# Altium project Debugging Board V1.PrjPcb
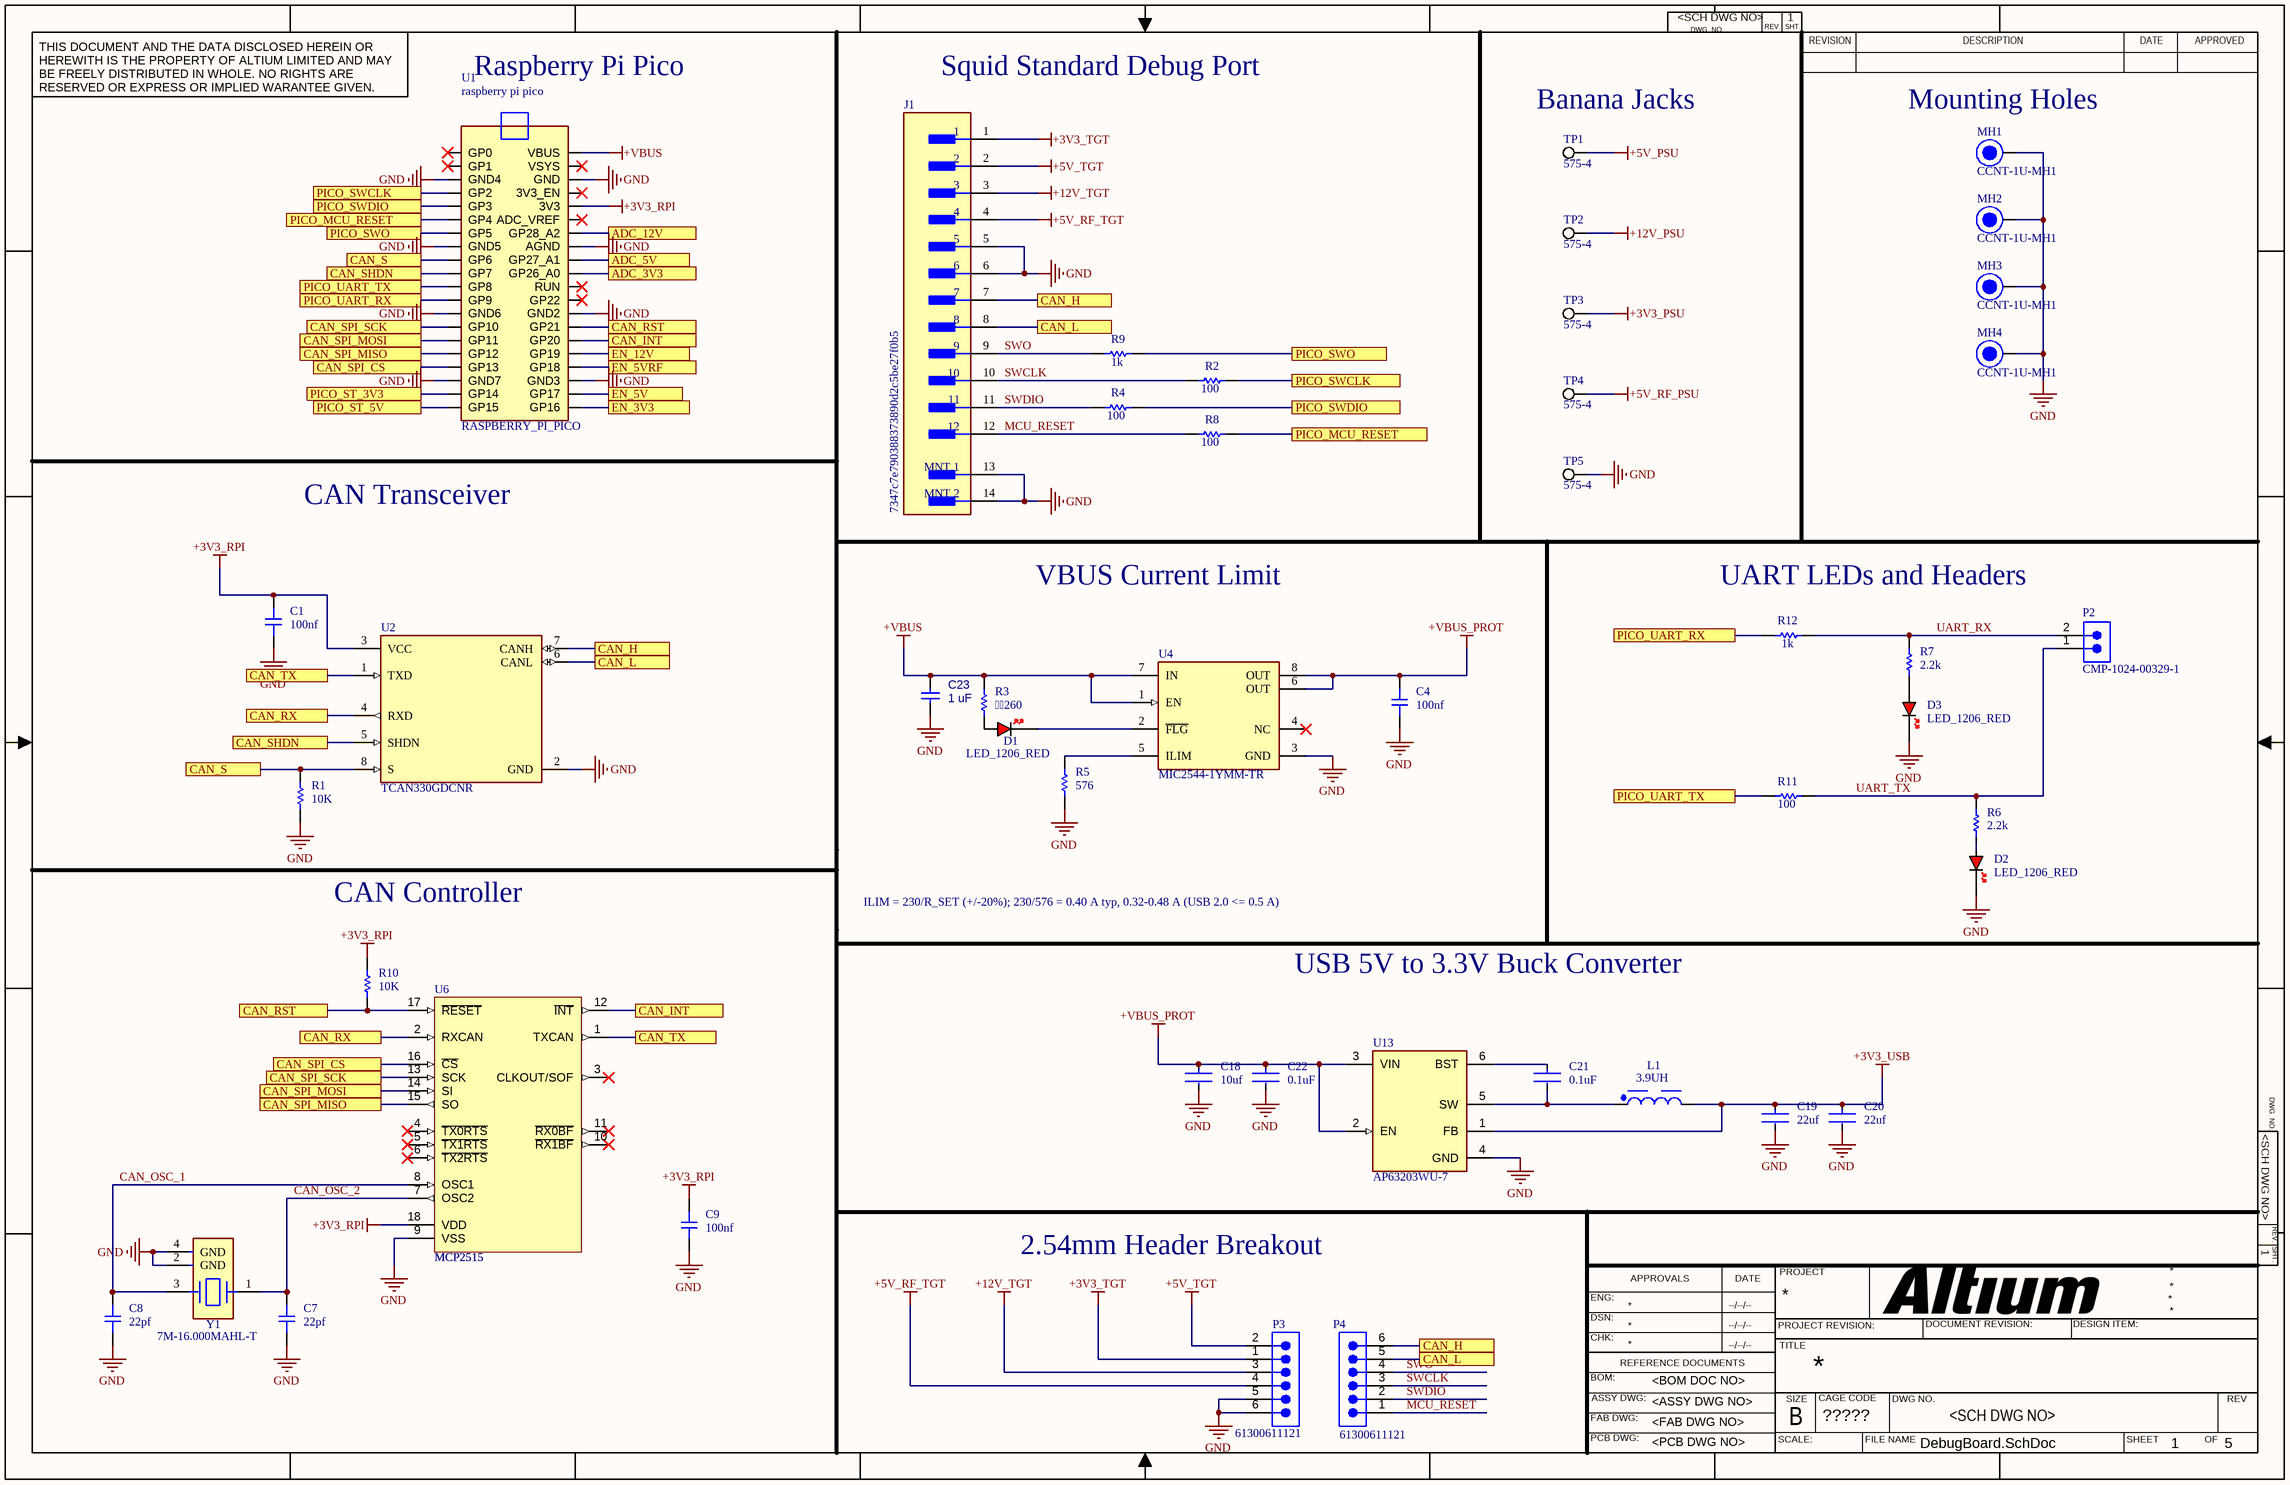
[diagram p0: DebugBoard.SchDoc]
CAGE_CODE: ?????; CONTRACT_NUMBER: <CONTRACT NO>; DOC_NO_ASSY_DWG: <ASSY DWG NO>; DOC_NO_BOM: <BOM DOC NO>; DOC_NO_FAB_DWG: <FAB DWG NO>; DOC_NO_SCH_DWG: <SCH DWG NO>; PCB_2_DEC_TOL: +/-.01; PCB_3_DEC_TOL: +/-.010; PCB_ANG_TOL: +/-1/2; PCB_ASSEMBLY_NO: <PCB ASSY NO>; PCB_CHECKER: - -----; PCB_CHECKER_APP_DATE: --/--/----; PCB_DESIGNER: - -----; PCB_DESIGNER_APP_DATE: --/--/----; PCB_DWG_NO: <PCB DWG NO>; PCB_ENGINEER: - -----; PCB_ENGINEER_APP_DATE: --/--/----; PCB_PART_NUMBER: <PCB PN>; PCB_REV: A; SCH_REV: A
6 sheets, 161 parts. Net scope: global (net labels, ports and power ports of the same name join across sheets).
Board file: DebugBoard.PcbDoc
Sheets:
  DebugBoard.SchDoc
  DebugBoardMuxes.SchDoc
  DebugBoardPowerControl.SchDoc
  DebugBoard3V3Mux.SchDoc
  DebugBoard5VMux.SchDoc
  DebugBoardLimiters.SchDoc

## Sheet DebugBoard.SchDoc
size 431 x 279 mm; SheetNumber: 1; SheetTotal: 5; ENG_APP_DATE: --/--/--; DSN_APP_DATE: --/--/--; CHK_APP_DATE: --/--/--

### Parts
C1  100nf  [CAP_0805]
C4  100nf  [CAP_0805]
C7  22pf  [CAP_0805]
C8  22pf  [CAP_0805]
C9  100nf  [CAP_0805]
C18  10uf  [FP-CGA5L-0_3-0_1-IPC_A]
C19  22uf  [FP-GCM31C-0_2-e0_3_0_8-IPC_A]
C20  22uf  [FP-GCM31C-0_2-e0_3_0_8-IPC_A]
C21  0.1uF  [FP-C0805C-DN-MFG]
C22  0.1uF  [FP-C0805C-DN-MFG]
C23  1 uF  [CAPC2013X145X50ML20T25]
D1  LED_1206_RED  [LED_1206_RED]
D2  LED_1206_RED  [LED_1206_RED]
D3  LED_1206_RED  [LED_1206_RED]
J1  7347c7e790388373890d2c5be27f0b5  [FP-BM12B-GHS-TBT_LF_SN-MFG]
L1  3.9UH  [WE-PD2SR_7850]
MH1  CCNT-1U-MH1  [CCNT-1U-MH1-Footprint-1]
MH2  CCNT-1U-MH1  [CCNT-1U-MH1-Footprint-1]
MH3  CCNT-1U-MH1  [CCNT-1U-MH1-Footprint-1]
MH4  CCNT-1U-MH1  [CCNT-1U-MH1-Footprint-1]
P2  CMP-1024-00329-1  [SMTC-TSW-102-26-XX-S]
P3  61300611121  [61300611121]
P4  61300611121  [61300611121]
R1  10K  [RES_0805]
R2  100  [RES_0805]
R3  260  [RES_0805]
R4  100  [RES_0805]
R5  576  [RES_0805]
R6  2.2k  [RES_0805]
R7  2.2k  [RES_0805]
R8  100  [RES_0805]
R9  1k  [RES_0805]
R10  10K  [RES_0805]
R11  100  [RES_0805]
R12  1k  [RES_0805]
TP1  575-4  [KSTN-575-4]
TP2  575-4  [KSTN-575-4]
TP3  575-4  [KSTN-575-4]
TP4  575-4  [KSTN-575-4]
TP5  575-4  [KSTN-575-4]
U1  RASPBERRY_PI_PICO  [RASPBERRY_PI_PICO]
U2  TCAN330GDCNR  [FP-DCN0008A-MFG]
U4  MIC2544-1YMM-TR  [FP-MSOP-8LD-PL-1-MFG]
U6  MCP2515  [SOIC-SO18_M]
U13  AP63203WU-7  [FP-TSOT26-MFG]
Y1  7M-16.000MAHL-T  [FP-7M-MFG]

### Ports
ADC_3V3, ADC_5V, ADC_12V, CAN_H, CAN_INT, CAN_L, CAN_RST, CAN_RX, CAN_S, CAN_SHDN, CAN_SPI_CS, CAN_SPI_MISO, CAN_SPI_MOSI, CAN_SPI_SCK, CAN_TX, EN_3V3, EN_5V, EN_5VRF, EN_12V, PICO_MCU_RESET, PICO_ST_3V3, PICO_ST_5V, PICO_SWCLK, PICO_SWDIO, PICO_SWO, PICO_UART_RX, PICO_UART_TX

### Nets
+3V3_PSU: TP3.1
+3V3_RPI: C1.2 C9.2 R10.2 U1.3V3 U2.3(VCC) U6.18(VDD)
+3V3_TGT: J1.1 P3.1
+3V3_USB: C19.1 C20.1 L1.2 U13.1(FB)
+5V_PSU: TP1.1
+5V_RF_PSU: TP4.1
+5V_RF_TGT: J1.4 P3.4
+5V_TGT: J1.2 P3.2
+12V_PSU: TP2.1
+12V_TGT: J1.3 P3.3
+VBUS: C23.1 R3.2 U1.VBUS U4.1(EN) U4.7(IN)
+VBUS_PROT: C4.2 C18.1 C22.1 U4.6(OUT) U4.8(OUT) U13.2(EN) U13.3(VIN)
GND: C1.1 C4.1 C7.1 C8.1 C9.1 C18.2 C19.2 C20.2 C22.2 C23.2 D2.K D3.K J1.5 J1.6 J1.13(MNT_1) J1.14(MNT_2) MH1.MH1 MH2.MH1 MH3.MH1 MH4.MH1 P3.5 P3.6 R1.1 R5.2 TP5.1 U1.AGND U1.GND U1.GND2 U1.GND3 U1.GND4 U1.GND5 U1.GND6 U1.GND7 U2.2(GND) U4.3(GND) U6.9(VSS) U13.4(GND) Y1.2(GND) Y1.4(GND)
ADC_3V3: U1.GP26_A0 ; port ADC_3V3
ADC_5V: U1.GP27_A1 ; port ADC_5V
ADC_12V: U1.GP28_A2 ; port ADC_12V
CAN_H: J1.7 P4.6 U2.7(CANH) ; port CAN_H
CAN_INT: U1.GP20 U6.12(~{INT}) ; port CAN_INT
CAN_L: J1.8 P4.5 U2.6(CANL) ; port CAN_L
CAN_OSC_1: C8.2 U6.8(OSC1) Y1.3
CAN_OSC_2: C7.2 U6.7(OSC2) Y1.1
CAN_RST: R10.1 U1.GP21 U6.17(~{RESET}) ; port CAN_RST
CAN_RX: U2.4(RXD) U6.2(RXCAN) ; port CAN_RX
CAN_S: R1.2 U1.GP6 U2.8(S) ; port CAN_S
CAN_SHDN: U1.GP7 U2.5(SHDN) ; port CAN_SHDN
CAN_SPI_CS: U1.GP13 U6.16(~{CS}) ; port CAN_SPI_CS
CAN_SPI_MISO: U1.GP12 U6.15(SO) ; port CAN_SPI_MISO
CAN_SPI_MOSI: U1.GP11 U6.14(SI) ; port CAN_SPI_MOSI
CAN_SPI_SCK: U1.GP10 U6.13(SCK) ; port CAN_SPI_SCK
CAN_TX: U2.1(TXD) U6.1(TXCAN) ; port CAN_TX
EN_3V3: U1.GP16 ; port EN_3V3
EN_5V: U1.GP17 ; port EN_5V
EN_5VRF: U1.GP18 ; port EN_5VRF
EN_12V: U1.GP19 ; port EN_12V
MCU_RESET: J1.12 P4.1 R8.2
PICO_MCU_RESET: R8.1 U1.GP4 ; port PICO_MCU_RESET
PICO_ST_3V3: U1.GP14 ; port PICO_ST_3V3
PICO_ST_5V: U1.GP15 ; port PICO_ST_5V
PICO_SWCLK: R2.1 U1.GP2 ; port PICO_SWCLK
PICO_SWDIO: R4.1 U1.GP3 ; port PICO_SWDIO
PICO_SWO: R9.1 U1.GP5 ; port PICO_SWO
PICO_UART_RX: R12.1 U1.GP9 ; port PICO_UART_RX
PICO_UART_TX: R11.1 U1.GP8 ; port PICO_UART_TX
SWCLK: J1.10 P4.3 R2.2
SWDIO: J1.11 P4.2 R4.2
SWO: J1.9 P4.4 R9.2
UART_RX: P2.2 R7.2 R12.2
UART_TX: P2.1 R6.2 R11.2
NetC21_1: C21.1 U13.6(BST)
NetC21_2: C21.2 L1.1 U13.5(SW)
NetD1_A: D1.A R3.1
NetD1_K: D1.K U4.2(~{FLG})
NetD2_A: D2.A R6.1
NetD3_A: D3.A R7.1
NetR5_1: R5.1 U4.5(ILIM)

Not connected (* = marked no-connect by the designer): U1 3V3_EN* ADC_VREF* GP0* GP1* GP22* RUN* VSYS*; U4 4(NC)*; U6 3(CLKOUT/SOF)* 4(~{TX0RTS})* 5(~{TX1RTS})* 6(~{TX2RTS})* 10(~{RX1BF})* 11(~{RX0BF})*

### Notes on the sheet
- Raspberry Pi Pico
- Squid Standard Debug Port
- (near TP1) Banana Jacks
- (near MH1) Mounting Holes
- CAN Transceiver
- VBUS Current Limit
- UART LEDs and Headers
- CAN Controller
- ILIM = 230/R_SET (+/-20%); 230/576 = 0.40 A typ, 0.32-0.48 A (USB 2.0 <= 0.5 A)
- USB 5V to 3.3V Buck Converter
- 2.54mm Header Breakout
- DWG. NO.
- REV.
- SHT.
- THIS DOCUMENT AND THE DATA DISCLOSED HEREIN OR HEREWITH IS THE PROPERTY OF ALTIUM LIMITED AND MAY BE FREELY DISTRIBUTED IN WHOLE. NO RIGHTS ARE RESERVED OR EXPRESS OR IMPLIED WARANTEE GIVEN.
- REVISION
- DESCRIPTION
- DATE
- APPROVED
- ENG:
- APPROVALS
- PROJECT
- DSN:
- CHK:
- REFERENCE DOCUMENTS
- PROJECT REVISION:
- TITLE
- DOCUMENT REVISION:
- DESIGN ITEM:
- BOM:
- FAB DWG:
- PCB DWG:
- ASSY DWG:
- SCALE:
- SIZE
- B
- CAGE CODE
- FILE NAME
- DWG NO.
- SHEET
- OF
- REV
- (in symbol CMP-204-000001-1) raspberry pi pico

### Library data of the parts
C1 C4 C7-C9 = CMP-001-00121-1: Capacitor SMD 0805 - Generic; Source: Generic_Schematic_Library.SchLib; Design Item ID: CAP_0805
C18 = CMP-08246-002111-1: Cap Ceramic 10uF 35V X7R 10% Pad SMD 1206 +125°C Automotive T/R; Height: 1.6mm; Thickness: 0.075inch; Tolerance: 10%; Voltage Rating (DC): 35V; Min Operating Temperature: -55°C; Width: 0.063inch; Ratings: AEC-Q200; Dielectric: X7R; Voltage Rating: 35V; REACH SVHC: No SVHC; Case Code (Imperial): 1206; Features: Soft Termination; Mount: Surface Mount; Case Code (Metric): 3216; Lead Free: Lead Free; Length: 0.126inch; Package Quantity: 2000; Packaging: Tape and Reel; Case/Package: 1206; Capacitance: 10uF; Max Operating Temperature: 125°C; Weight: 0.000571oz; Termination: SMD/SMT
C19 C20 = CMP-06035-059468-1: Ceramic Capacitor for Automotive 22uF ±10% 10VDC X7R 1206 Embossed T/R
C21 C22 = CMP-03020-000950-1: CAP CER 0.1UF 50V X7R 0805; Manufacturer: KEMET; Manufacturer Part Number: C0805C104J5RACTU; Temperature Coefficient: 30ppm/°C; Value: 0.10 μF; Material: Ceramic; Tolerance: 0.05; Voltage Rating: 50 V; Digikey Description: CAP CER 0.1UF 50V X7R 0805; Octopart: https://octopart.com/c0805c104j5ractu-kemet-104634; RoHS: TRUE; Device Class L1: Passive Components; Temperature Characteristic: X7R; Device Class L3: Ceramic Capacitors; Lead Free: Yes; Automotive: No; Category: Cap; Temperature: -55°C to +125°C; Package: C0805C-DN; Temperature Range High: +125°C; Height: 0.88mm; Capacitance: 0.10 μF; Temperature Range Low: -55°C; ComponentLink2Description: Datasheet; ComponentLink2URL: https://content.kemet.com/datasheets/KEM_C1003_C0G_SMD.pdf; Ipc Land Pattern Name: CAPC200125X78; Device Class L2: Capacitors; Mouser Description: Multilayer Ceramic Capacitors MLCC - SMD/SMT 50volts 0.1uF X7R 5%
C23 = CMP-001-00010-9: Chip Capacitor, 1 uF, +/-10%, 25 V, 0805 (2012 Metric); Voltage Rating: 25V; Value: 1µF; Tolerance: 10%; Capacitor Type: Ceramic; Min Operating Temperature: -55°C; Max Operating Temperature: 125°C; Pins: 2; Mounting Technology: SM; RoHS Compliant: True; Case/Package: 0805
D1-D3 = CMP-004-00077-1: LED 1206 RED SMD; Source: Generic_Schematic_Library.SchLib; Design Item ID: LED_1206_RED
J1 = CMP-002-00170-1: CONN HEADER SMD 12POS 1.25MM; Current Rating: 1A; Number Of Contacts: 12; Voltage Rating (AC): 50V; Wire/Cable Gauge: 26AWG; Orientation: Straight; Reach SVHC Compliant: Yes; Contact Material: Bronze; Source: SquidSat Deployable Antenna REV1_1.SCHLIB; Packaging: Cut Tape; Termination: SMD/SMT; Number of Rows: 1; Min Operating Temperature: -25°C; Mount: Surface Mount; Pitch: 1.25mm; Housing Material: Nylon; Number of Positions: 12; Voltage Rating: 50V; Housing Color: Natural; Max Operating Temperature: 85°C; Lead Free: Lead Free; Contact Plating: Tin; Series: GH; Design Item ID: 7347c7e790388373890d2c5be27f0b5
L1 = CMP-1397-00011-3: Fixed Ind 3.9UH 3.8A 20 Mohm SMD; Core Material: Composite, Ferrite; Inductance: 3.9µH; Series Resistance: 16.7mΩ; Tolerance: 30%; Test Frequency: 100kHz; Shielding: Shielded; Self Resonant Frequency: 45MHz; Saturation Current: 4A; Number of Pins: 2; Max Operating Temperature: 125°C; Mount: Surface Mount; Length: 7.8mm; DC Resistance (DCR): 16.7mΩ; Case/Package: SMD/SMT; Min Operating Temperature: -40°C; Width: 7mm; REACH SVHC: Unknown; RMS Current (Irms): 3.8A; Max DC Current: 3.8A; Composition: Wirewound; Termination: SMD/SMT; Inductance Tolerance: 30%; Ambient Temperature Range High: 85°C; Ambient Temperature Range Low: -40°C; Depth: 7mm; Height - Seated (Max): 4.4958mm; RoHS: Compliant; Height: 4.8mm; Current Rating: 3.8A
MH1-MH4 = CMP-002-00076-1: BOTTOM LEFT Mounting Hole for blank 1U CubeSat template used on CCNT
P2 = CMP-002-00166-1: 0.025" SQ Post Header, Through-hole, Vertical, -55 to 125 degC, 2.54 mm Pitch, 2-Pin, Male, RoHS; Manufacturer: Samtec; PartNumber: TSW-102-26-F-S; Available Preview Images: 2D; Pitch: 2.54 mm; ComponentLink1URL: http://www.samtec.com; Design Item ID: CMP-1024-00329-1; DatasheetVersion: F-214; Orientation: Vertical; Mounting Technology: Through-hole; ComponentLink2URL: http://www.samtec.com/documents/webfiles/pdf/TSW_TH.PDF; ComponentLink3URL: http://www.samtec.com/documents/webfiles/cpdf/TSW-XXX-XX-XXX-X-XX-XXX-MKT.pdf; ComponentLink2Description: Datasheet; Source: SquidSat Deployable Antenna REV1_1.SCHLIB; ComponentLink3Description: Package Specification; RoHS: True; Temperature Range: -55 to 125 degC; PackageVersion: DM, 8/1988; PackageReference: TSW-102-26-XX-S; PackageDescription: .025[0.64] SQ. Post Terminal Strip Assembly; ComponentLink1Description: Manufacturer URL
P3 P4 = CMP-1502-01070-4: THT Vertical Pin Header WR-PHD, Pitch 2.54 mm, Single Row, 6 pins; Pitch: 2.54mm; Operating Supply Voltage: 250V; Connector Type: Male Pin; Gender: Male; Number of Positions: 6; Contact Resistance: 20mΩ; Current Rating: 3A; Termination: Through Hole; Color: Black; Number of Pins: 6; Lead Pitch: 2.54mm; Height: 8.89mm; RoHS: Compliant; Lead Free: Lead Free; Contact Mating Length: 5.9944mm; Contact Plating: Gold; Contact Gender: Male; Packaging: Bulk; Orientation: Vertical; Mount: Through Hole; Voltage Rating: 250V; Number of Rows: 1; Max Operating Temperature: 105°C; Min Operating Temperature: -40°C; Housing Material: PBT; Contact Material: Gold; Number of Contacts: 6
R1-R12 = CMP-009-00183-1: Resistor SMD 0805 - Generic; Source: Generic_Schematic_Library.SchLib; Design Item ID: RES_0805
TP1-TP5 = CMP-2000-05649-1: Banana Jack, Non-Insulated, 1-Pin THD, RoHS, Bulk; Manufacturer: Keystone-Electronics; Package Version: Rev. B, 11/1994; Plug/Mating Plug Diameter: StandardBanana; Gender: Female; Package Reference: 575-4; Operating Temperature: -; Contact Material: Brass; Packaging: Bulk; Series: -; Category: Connectors,Interconnects; Color: -; Type: BananaJack; Contact Finish: Nickel; Features: -; Family: BananaandTipConnectors-Jacks,Plugs; Body Material: -; Manufacturer URL: http://www.keyelco.com/; Termination: Solder; Insulation: Non-Insulated; Datasheet Version: Rev. B, 11/1994; Mounting Technology: ThroughHole; Package URL: http://www.keyelco.com/product-pdf.cfm?p=2379; Mounting Type: ThroughHole; Package Description: 1-Pin Through Hole Device, Dia 7.92 mm; Datasheet URL: http://www.keyelco.com/product-pdf.cfm?p=2379; Wire Gauge: -
U1 = CMP-204-000001-1: Raspberry Pi Board, Arm Cortex-M0+; Core Architecture:Arm; Core Sub-Architecture:Cortex-M0+; Kit Contents:Raspberry Pi Pico Board; No. Of Bits:32Bit; Silicon Core Number:Rp2040; Silicon Manufacturer:Raspberry Pi; Component Type: Standard; Pin Count: 40; Design Item ID: RASPBERRY_PI_PICO; Value: RASPBERRY_PI_PICO; Source: RASPBERRY_PI_PICO.SchLib; MP: RASPBERRY PI PICO; Package: None; MF: Raspberry Pi; SnapEDA_Link: https://www.snapeda.com/parts/RASPBERRY%20PI%20PICO/Raspberry+Pi/view-part/?ref=snap; Check_prices: https://www.snapeda.com/parts/RASPBERRY%20PI%20PICO/Raspberry+Pi/view-part/?ref=eda
U2 = CMP-031-00060-1: IC TRANSCEIVER 1/1 SOT23-8; Data Rate: 1Mbps; Lead Free: Lead Free; Pin Count: 8; Mount: Surface Mount; Min Operating Temperature: -40°C; Packaging: Tape and Reel; Case/Package: SOT-23-8; Source: Squid FCR V0.SCHLIB; Component Type: Standard; Max Operating Temperature: 125°C; Design Item ID: CMP-04872-000178-1; RoHS Compliant: Yes
U4 = CMP-00008-1: IC SW CURR LIMIT HI SIDE 8-MSOP / USB Power Switch Single 5.5V 0.1A to 1.5A 8-Pin MSOP T/R; Manufacturer Lifecycle Status: REL; Fault Protection: Over Temperature; Output Configuration: High Side; Number of Outputs: 1; On-State Resistance: 120mΩ; Turn-Off Delay Time: 22µs; Value: 120mΩ; Nominal Supply Current: 5µA; Min Supply Voltage: 2.7V; Turn-On Delay Time: 2ms; RoHS: Compliant; Min Operating Temperature: -40°C; Current Rating: 1.5A; Max Operating Temperature: 125°C; Lifecycle Status: Production; Lead Free: Lead Free; Radiation Hardening: No; Max Supply Voltage: 5.5V; Schedule B: 8542390000, 8542390000; Case/Package: MSOP; Max Output current: 1.5A; Projected EOL Date: 2034-06-14; Ambient Temperature Range High: 85°C; Pins: 8; Country of Origin: Thailand; HS Code: 8542.39.0090; Number of Channels: 1; Mounting Technology: Surface Mount; Nominal Supply Voltage: 5.5V; Country of Fabrication: United States of America; Height: 1.1mm; Output Current: 1.5A; Export Control Classification Number (ECCN) Code: EAR99; Part Series: -; Country of Assembly: Thailand; Harmonized Tariff Schedule (HTS) Code: 8542.39.0060
U6 = CMP-330-000002-1: Stand-Alone CAN Controller With SPI Interface, 18-Pin SOIC, Extended Temperature; Design Item ID: CMP-0186-00035-2; ComponentLink1Description: Manufacturer URL; PackageDescription: 18-Lead Plastic Small Outline (SO) - Wide 7.50mm Body [SOIC]; Code_JEDEC: MS-013; PackageVersion: revBB, Aug-2009; Source: Squid FCR V0.SCHLIB; ComponentLink3URL: http://www.microchip.com/stellent/groups/techpub_sg/documents/packagingspec/en012702.pdf; DatasheetVersion: revF, Oct-2010; RevisionNote: URLs added. DatasheetVersion updated.; Component Type: Standard; Pin Count: 18; Value: MCP2515; ComponentLink2URL: http://ww1.microchip.com/downloads/en/DeviceDoc/21801f.pdf; ComponentLink3Description: Package Specification; ComponentLink1URL: http://www.microchip.com/; PackageReference: SOIC-SO18; ComponentLink2Description: Datasheet
U13 = CMP-12757-000006-1: IC REG BUCK 3.3V 2A TSOT26; Manufacturer: Diodes Inc.; Output Type: Fixed; Min Supply Voltage: 3.8V; Number Of Outputs: 1; Max Junction Temp: +160°C; Nominal Supply Current: 22uA; Standoff Height: 0.01mm; Switching Frequency: 1.1MHz; Max Supply Voltage: 32V; ComponentLink2Description: Datasheet; Device Class L1: Integrated Circuits (ICs); Temperature: to +160°C; Device Class L3: Voltage Regulators - Switching; RoHS: TRUE; Octopart: https://octopart.com/ap63203wu-7-diodes+inc.-98099550; Output Voltage: 3.3V; Lead Free: Yes; ComponentLink2URL: https://www.diodes.com/assets/Datasheets/AP63200-AP63201-AP63203-AP63205.pdf; Digikey Description: IC REG BUCK 3.3V 2A TSOT26; Footprint Url: https://www.diodes.com/assets/Package-Files/TSOT26.pdf; Ambient Temperature Range High: +85°C; Height: 1mm; Automotive: No; Temperature Range High: +160°C; Switching Topology: Buck; Output Current: 2A; Package: TSOT26; Category: IC; Mouser Description: AP63203 Series 3.3 V 2 A SMT Fixed Low IQ Synchronous Buck - TSOT-26; Device Class L2: Power Management ICs; Ambient Temperature Range Low: -40°C; Manufacturer Part Number: AP63203WU-7
Y1 = CMP-003-00073-1: Crystal 16MHz, 30ppm, 22pF, 60O; ESR (Equivalent Series Resistance): 80; Pins: 4; Component Type: Standard; Min Operating Temperature: -40°C; Frequency: 16MHz; Frequency Stability: 30ppm; Max Operating Temperature: 85°C; Frequency Tolerance: 30ppm; Load Capacitance: 22pF; Design Item ID: CMP-18717-000072-1; Source: Squid FCR V0.SCHLIB

## Sheet DebugBoardMuxes.SchDoc
size 420 x 297 mm; SheetNumber: 2; SheetTotal: 2
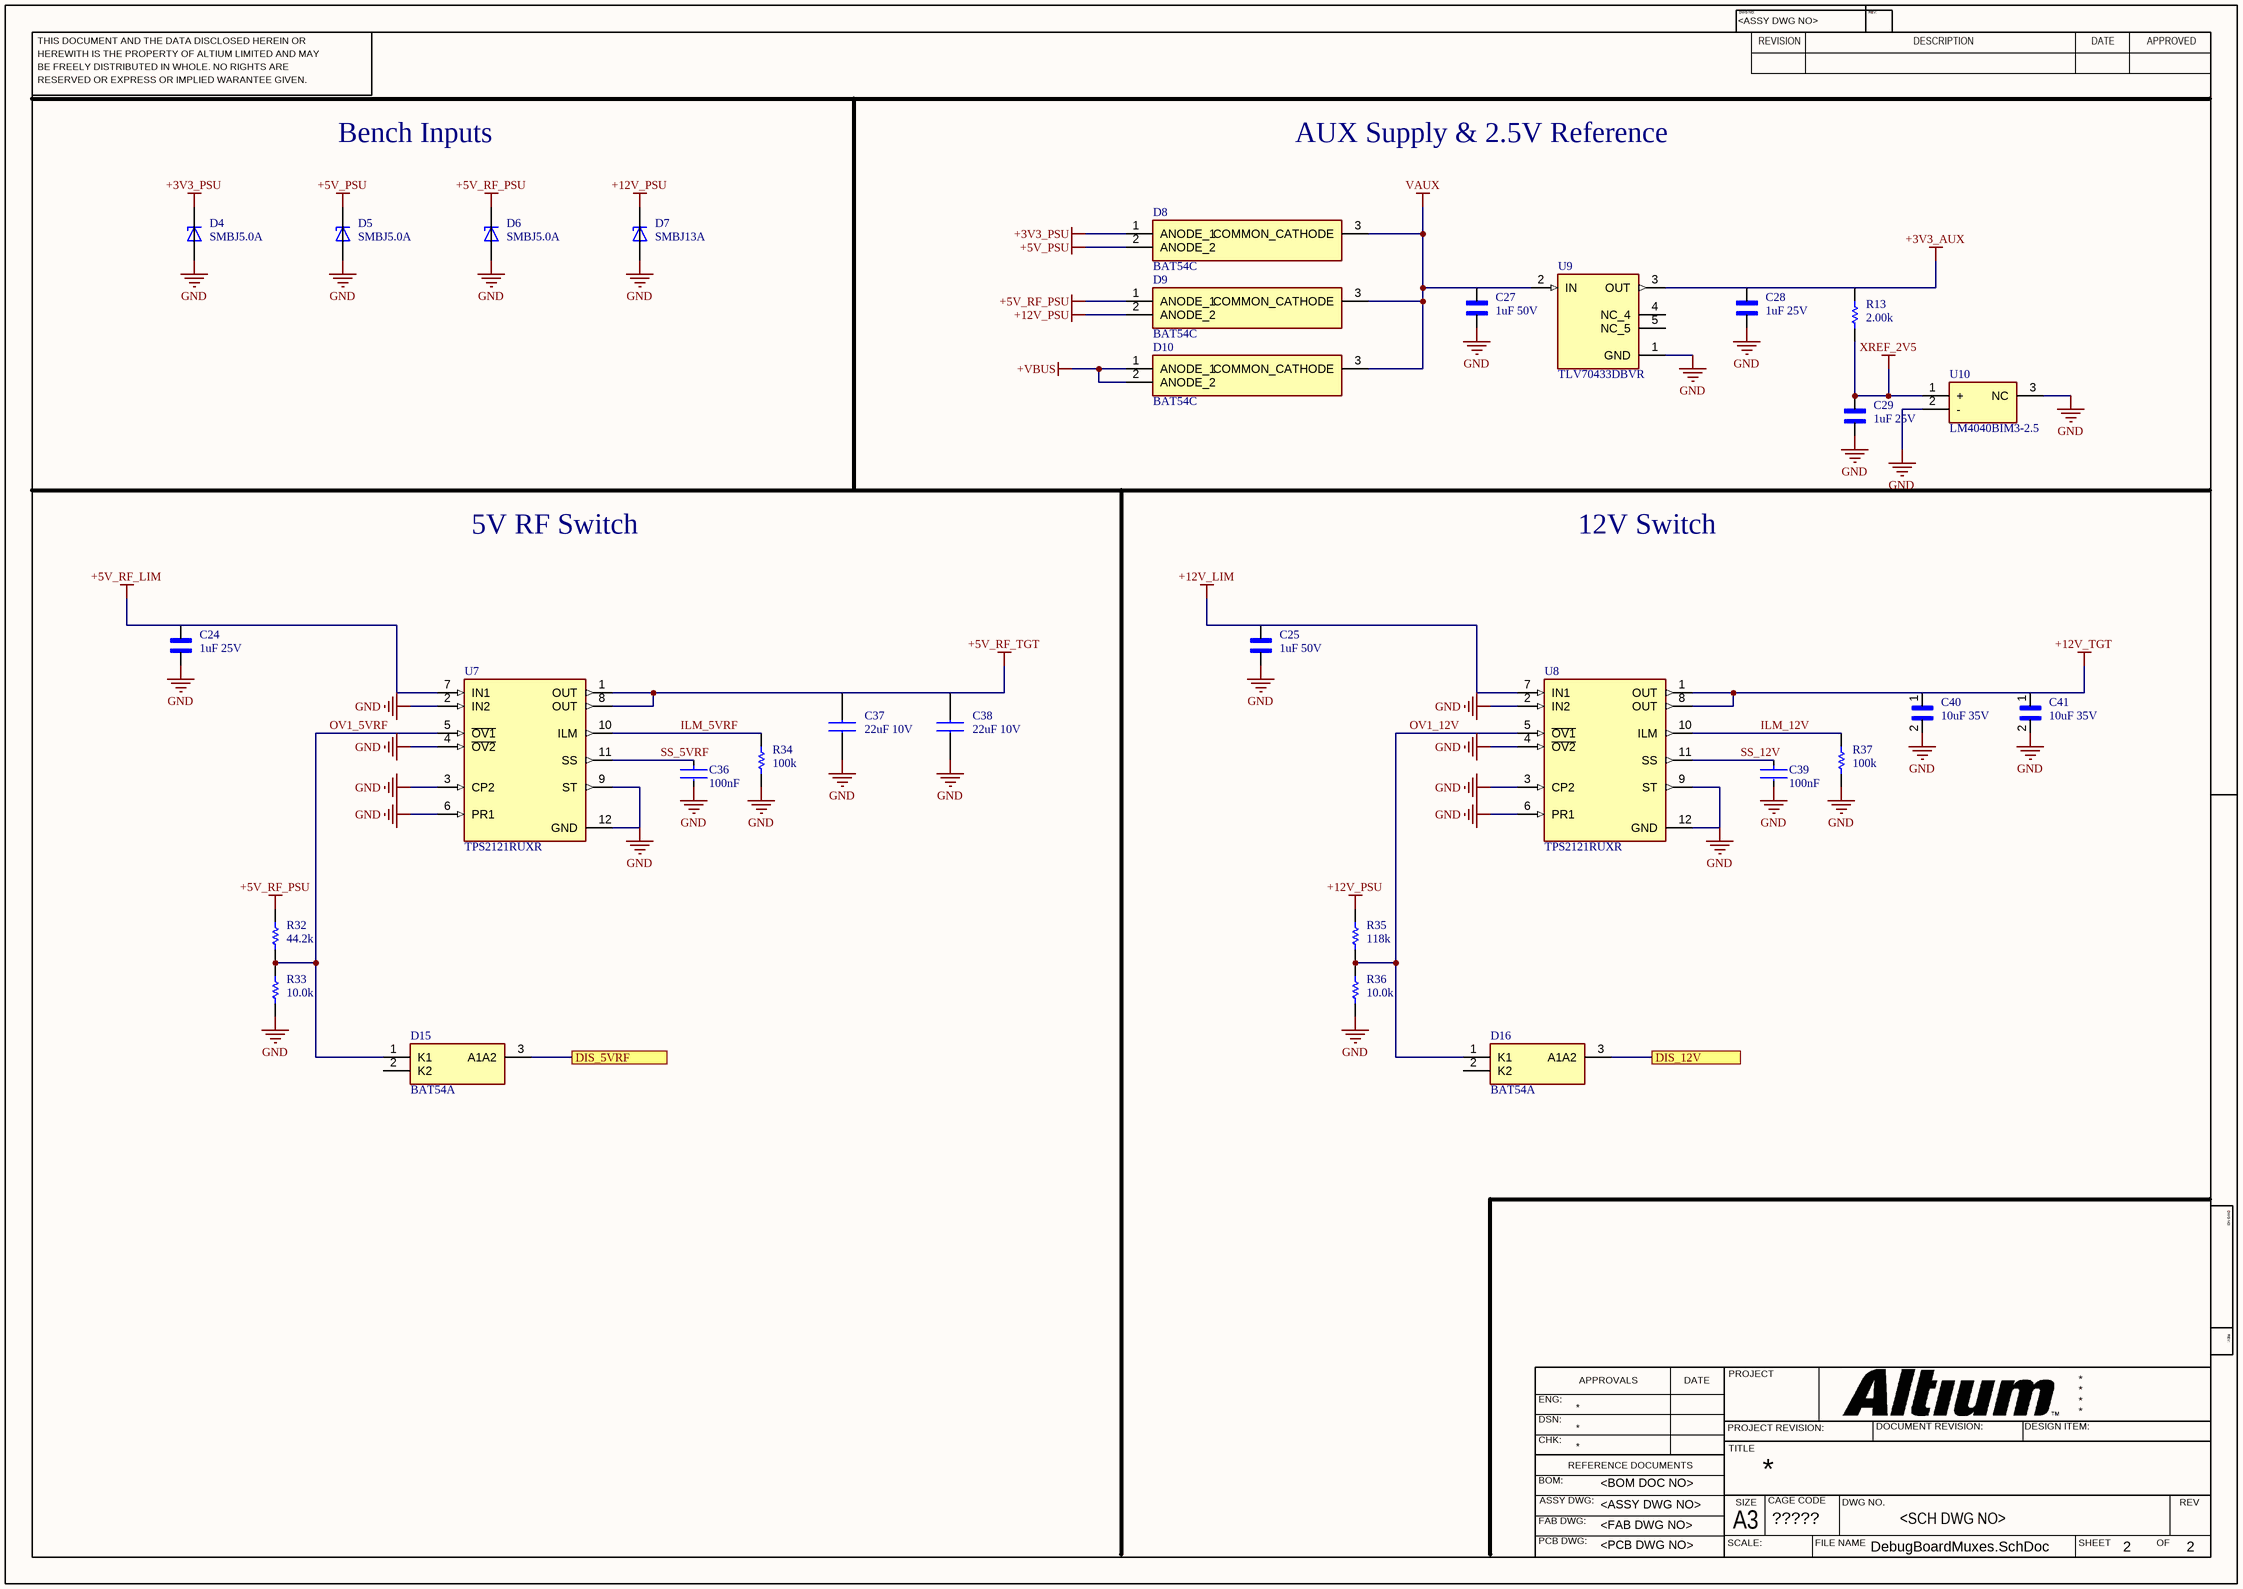
[diagram p1: DebugBoardMuxes.SchDoc]

### Parts
C24  1uF 25V  [CAPC2012X135N]
C25  1uF 50V  [CAPC2012X135N]
C27  1uF 50V  [CAPC2012X135N]
C28  1uF 25V  [CAPC2012X135N]
C29  1uF 25V  [CAPC2012X135N]
C36  100nF  [FP-C0805C-DN-MFG]
C37  22uF 10V  [CAPC3116X180N]
C38  22uF 10V  [CAPC3116X180N]
C39  100nF  [FP-C0805C-DN-MFG]
C40  10uF 35V  [CAPC3216X190N]
C41  10uF 35V  [CAPC3216X190N]
D4  SMBJ5.0A  [DIOM4336X265N]
D5  SMBJ5.0A  [DIOM4336X265N]
D6  SMBJ5.0A  [DIOM4336X265N]
D7  SMBJ13A  [DIOM4336X265N]
D8  BAT54C  [BAT54C215]
D9  BAT54C  [BAT54C215]
D10  BAT54C  [BAT54C215]
D15  BAT54A  [SOT95P230X110-3N]
D16  BAT54A  [SOT95P230X110-3N]
R13  2.00k  [RES_0805]
R32  44.2k  [RES_0805]
R33  10.0k  [RES_0805]
R34  100k  [RES_0805]
R35  118k  [RES_0805]
R36  10.0k  [RES_0805]
R37  100k  [RES_0805]
U7  TPS2121RUXR  [FP-RUX0012A-MFG]
U8  TPS2121RUXR  [FP-RUX0012A-MFG]
U9  TLV70433DBVR  [SOT95P280X145-5N]
U10  LM4040BIM3-2.5  [SOT95P237X112-3N]

### Ports
DIS_5VRF, DIS_12V

### Nets
+3V3_AUX: C28.1 R13.1 U9.3(OUT)
+3V3_PSU: D4.C D8.1(ANODE_1)
+5V_PSU: D5.C D8.2(ANODE_2)
+5V_RF_LIM: C24.1 U7.7(IN1)
+5V_RF_PSU: D6.C D9.1(ANODE_1) R32.1
+5V_RF_TGT: C37.1 C38.1 U7.1(OUT) U7.8(OUT)
+12V_LIM: C25.1 U8.7(IN1)
+12V_PSU: D7.C D9.2(ANODE_2) R35.1
+12V_TGT: C40.1 C41.1 U8.1(OUT) U8.8(OUT)
+VBUS: D10.1(ANODE_1) D10.2(ANODE_2)
GND: C24.2 C25.2 C27.2 C28.2 C29.2 C36.2 C37.2 C38.2 C39.2 C40.2 C41.2 D4.A D5.A D6.A D7.A R33.2 R34.2 R36.2 R37.2 U7.2(IN2) U7.3(CP2) U7.4(~{OV2}) U7.6(PR1) U7.9(ST) U7.12(GND) U8.2(IN2) U8.3(CP2) U8.4(~{OV2}) U8.6(PR1) U8.9(ST) U8.12(GND) U9.1(GND) U10.2(-) U10.3(NC)
VAUX: C27.1 D8.3(COMMON_CATHODE) D9.3(COMMON_CATHODE) D10.3(COMMON_CATHODE) U9.2(IN)
XREF_2V5: C29.1 R13.2 U10.1(+)
DIS_5VRF: D15.3(A1A2) ; port DIS_5VRF
DIS_12V: D16.3(A1A2) ; port DIS_12V
ILM_5VRF: R34.1 U7.10(ILM)
ILM_12V: R37.1 U8.10(ILM)
OV1_5VRF: D15.1(K1) R32.2 R33.1 U7.5(~{OV1})
OV1_12V: D16.1(K1) R35.2 R36.1 U8.5(~{OV1})
SS_5VRF: C36.1 U7.11(SS)
SS_12V: C39.1 U8.11(SS)

Not connected (* = marked no-connect by the designer): D15 2(K2); D16 2(K2); U9 4(NC_4) 5(NC_5)

### Notes on the sheet
- Bench Inputs
- AUX Supply & 2.5V Reference
- 5V RF Switch
- 12V Switch
- THIS DOCUMENT AND THE DATA DISCLOSED HEREIN OR
- HEREWITH IS THE PROPERTY OF ALTIUM LIMITED AND MAY
- DWG NO:
- REVISION
- REV:
- DESCRIPTION
- DATE
- APPROVED
- BE FREELY DISTRIBUTED IN WHOLE. NO RIGHTS ARE
- RESERVED OR EXPRESS OR IMPLIED WARANTEE GIVEN.
- ENG:
- APPROVALS
- PROJECT
- DSN:
- CHK:
- REFERENCE DOCUMENTS
- PROJECT REVISION:
- TITLE
- DOCUMENT REVISION:
- DESIGN ITEM:
- BOM:
- FAB DWG:
- PCB DWG:
- ASSY DWG:
- SCALE:
- A3
- SIZE
- CAGE CODE
- FILE NAME
- DWG NO.
- SHEET
- OF
- REV

### Library data of the parts
C24 C28 C29 = CL21B105KAFNNNE: 1 ÂµF Â±10% 25V Ceramic Capacitor X7R 0805 (2012 Metric); MF: Samsung Electro-Mechanics; SnapEDA_Link: https://www.snapeda.com/parts/CL21B105KAFNNNE/Samsung/view-part/?ref=snap; Package: SMD-2 Samsung; Value: 1uF 25V; MP: CL21B105KAFNNNE; Check_prices: https://www.snapeda.com/parts/CL21B105KAFNNNE/Samsung/view-part/?ref=eda
C25 C27 = GRM21BR71H105KA12L: SMD Capacitor X7R(EIA) with Capacitance: 1.0uF Tol. 10%. Rated Voltage: 50Vdc; MF: Murata; SnapEDA_Link: https://www.snapeda.com/parts/GRM21BR71H105KA12L/Murata/view-part/?ref=snap; Package: 805-2 Murata; Value: 1uF 50V; MP: GRM21BR71H105KA12L; Check_prices: https://www.snapeda.com/parts/GRM21BR71H105KA12L/Murata/view-part/?ref=eda
C36 C39 = CMP-03020-000950-1: as C21 on sheet DebugBoard; Voltage Rating: 50 V; Digikey Description: CAP CER 0.1UF 50V X7R 0805; Octopart: https://octopart.com/c0805c104j5ractu-kemet-104634; RoHS: TRUE; Device Class L1: Passive Components; Temperature Characteristic: X7R; Device Class L3: Ceramic Capacitors; Lead Free: Yes; Automotive: No; Category: Cap; Temperature: -55°C to +125°C; Package: C0805C-DN; Temperature Range High: +125°C; Height: 0.88mm; Capacitance: 0.10 μF; Temperature Range Low: -55°C; ComponentLink2Description: Datasheet; ComponentLink2URL: https://content.kemet.com/datasheets/KEM_C1003_C0G_SMD.pdf; Ipc Land Pattern Name: CAPC200125X78; Device Class L2: Capacitors; Mouser Description: Multilayer Ceramic Capacitors MLCC - SMD/SMT 50volts 0.1uF X7R 5%
C37 C38 = GCM31CR71A226KE02K: Capacitor GCM31 L=3.2mm W=1.6mm T=1.6mm; Manufacturer_Name: Murata Electronics; Geometry.Height: 1.8mm; Manufacturer_Part_Number: GCM31CR71A226KE02K; Mouser Part Number: 81-GCM31CR71A226KE2K; Mouser Price/Stock: https://www.mouser.co.uk/ProductDetail/Murata-Electronics/GCM31CR71A226KE02K?qs=QzBtWTOodeVgM6QlH6X51g%3D%3D; Arrow Part Number: GCM31CR71A226KE02K; Arrow Price/Stock: https://www.arrow.com/en/products/gcm31cr71a226ke02k/murata-manufacturing?region=nac; Datasheet Link: https://search.murata.co.jp/Ceramy/image/img/A01X/G101/ENG/GCM31CR71A226KE02-01A.pdf
C40 C41 = CGA5L1X7R1V106K160AE: 10 ÂµF Â±10% 35V é™¶ç“·ç”µå®¹å™¨ X7R 1206ï¼ˆ3216 å…¬åˆ¶ï¼‰; MF: TDK; Package: 3216 TDK; Price: None; Check_prices: https://www.snapeda.com/parts/CGA5L1X7R1V106K160AE/TDK/view-part/?ref=eda; Value: 10uF 35V; SnapEDA_Link: https://www.snapeda.com/parts/CGA5L1X7R1V106K160AE/TDK/view-part/?ref=snap; MP: CGA5L1X7R1V106K160AE; Availability: In Stock; Purchase-URL: https://pricing.snapeda.com/search/part/CGA5L1X7R1V106K160AE/?ref=eda
D4-D6 = SMBJ5.0A: TVS, 600 W, 5.0 V stand-off, 6.40-7.00 V breakdown, 9.2 V clamp, unidirectional, SMB; MF: Littelfuse; SnapEDA_Link: https://www.littelfuse.com/assetdocs/littelfuse-tvs-diode-smbj-datasheet; Package: SMB (DO-214AA); Value: SMBJ5.0A; MP: SMBJ5.0A; Check_prices: https://www.digikey.com/en/products/result?keywords=SMBJ5.0A%20Littelfuse
D7 = SMBJ13A: 600W, 15.2V, 5%, Unidirectional, TVS; MF: Taiwan Semiconductor Corporation; SnapEDA_Link: https://www.snapeda.com/parts/SMBJ13A/taiwan/view-part/?ref=snap; Package: SMD-2 Taiwan Semiconductor; Value: SMBJ13A; MP: SMBJ13A; Check_prices: https://www.snapeda.com/parts/SMBJ13A/taiwan/view-part/?ref=eda
D8-D10 = BAT54C_215: Schottky barrier diode,BAT54C 0.2A 30V NXP BAT54C,215, Dual SMT Schottky Diode, Common Cathode, 30V 200mA, 5ns, 3-Pin TO-236AB; Manufacturer_Name: Nexperia; Geometry.Height: 1.1mm; Manufacturer_Part_Number: BAT54C,215; Mouser Part Number: 771-BAT54C-T/R; Mouser Price/Stock: https://www.mouser.co.uk/ProductDetail/Nexperia/BAT54C215?qs=me8TqzrmIYV5SKKt13YKQA%3D%3D; Arrow Part Number: BAT54C,215; Arrow Price/Stock: https://www.arrow.com/en/products/bat54c215/nexperia.html?utm_currency=USD&region=asia; Datasheet Link: https://assets.nexperia.com/documents/data-sheet/BAT54_SER.pdf
D15 D16 = BAT54A_215: Diode Array 1 Pair Common Anode 30 V 200mA (DC) Surface Mount TO-236-3, SC-59, SOT-23-3; Manufacturer_Name: Nexperia; Manufacturer_Part_Number: BAT54A,215; Geometry.Height: 1.1mm; Mouser Part Number: 771-BAT54A-T/R; Mouser Price/Stock: https://www.mouser.co.uk/ProductDetail/Nexperia/BAT54A215?qs=me8TqzrmIYV%252BITv%2F8aeieg%3D%3D; Arrow Part Number: BAT54A,215; Arrow Price/Stock: https://www.arrow.com/en/products/bat54a215/nexperia.html?utm_currency=USD&region=europe; Datasheet Link: https://assets.nexperia.com/documents/data-sheet/BAT54A.pdf
R13 R32-R37 = CMP-009-00183-1: Resistor SMD 0805 - Generic; Source: Generic_Schematic_Library.SchLib; Design Item ID: RES_0805
U7 U8 = CMP-019-00076-1: 2.7-V to 22-V, 56-mΩ, 4.5-A, power mux with seamless switchover 12-VQFN-HR -40 to 125; Min Supply Voltage: 2.8V; Max Supply Voltage: 22V; Nominal Supply Current: 300µA; Max Operating Temperature: 125°C; Output Voltage: 22V; Pins: 12; Min Operating Temperature: -40°C
U9 = TLV70433DBVR: 150-mA 24-V ultra-low-IQ low-dropout (LDO) voltage regulator; MF: Texas Instruments; SnapEDA_Link: https://www.snapeda.com/parts/TLV70433DBVR/Texas+Instruments/view-part/?ref=snap; Package: SOT-23-5 Texas Instruments; Value: TLV70433DBVR; MP: TLV70433DBVR; Check_prices: https://www.snapeda.com/parts/TLV70433DBVR/Texas+Instruments/view-part/?ref=eda
U10 = LM4040BIM3-2.5_NOPB: 100-ppm/C precision micropower shunt voltage reference; Manufacturer_Name: Texas Instruments; Manufacturer_Part_Number: LM4040BIM3-2.5/NOPB; Geometry.Height: 1.12mm; Mouser Part Number: 926-LM4040BIM325NOPB; Mouser Price/Stock: https://www.mouser.co.uk/ProductDetail/Texas-Instruments/LM4040BIM3-2.5-NOPB?qs=QbsRYf82W3GDmxxHwxXlYw%3D%3D; Arrow Part Number: LM4040BIM3-2.5/NOPB; Arrow Price/Stock: https://www.arrow.com/en/products/lm4040bim3-2.5nopb/texas-instruments; Datasheet Link: https://datasheet.datasheetarchive.com/originals/distributors/Datasheets-DGA16/867642.pdf

## Sheet DebugBoardPowerControl.SchDoc
size 420 x 297 mm; SheetNumber: 3; SheetTotal: 6
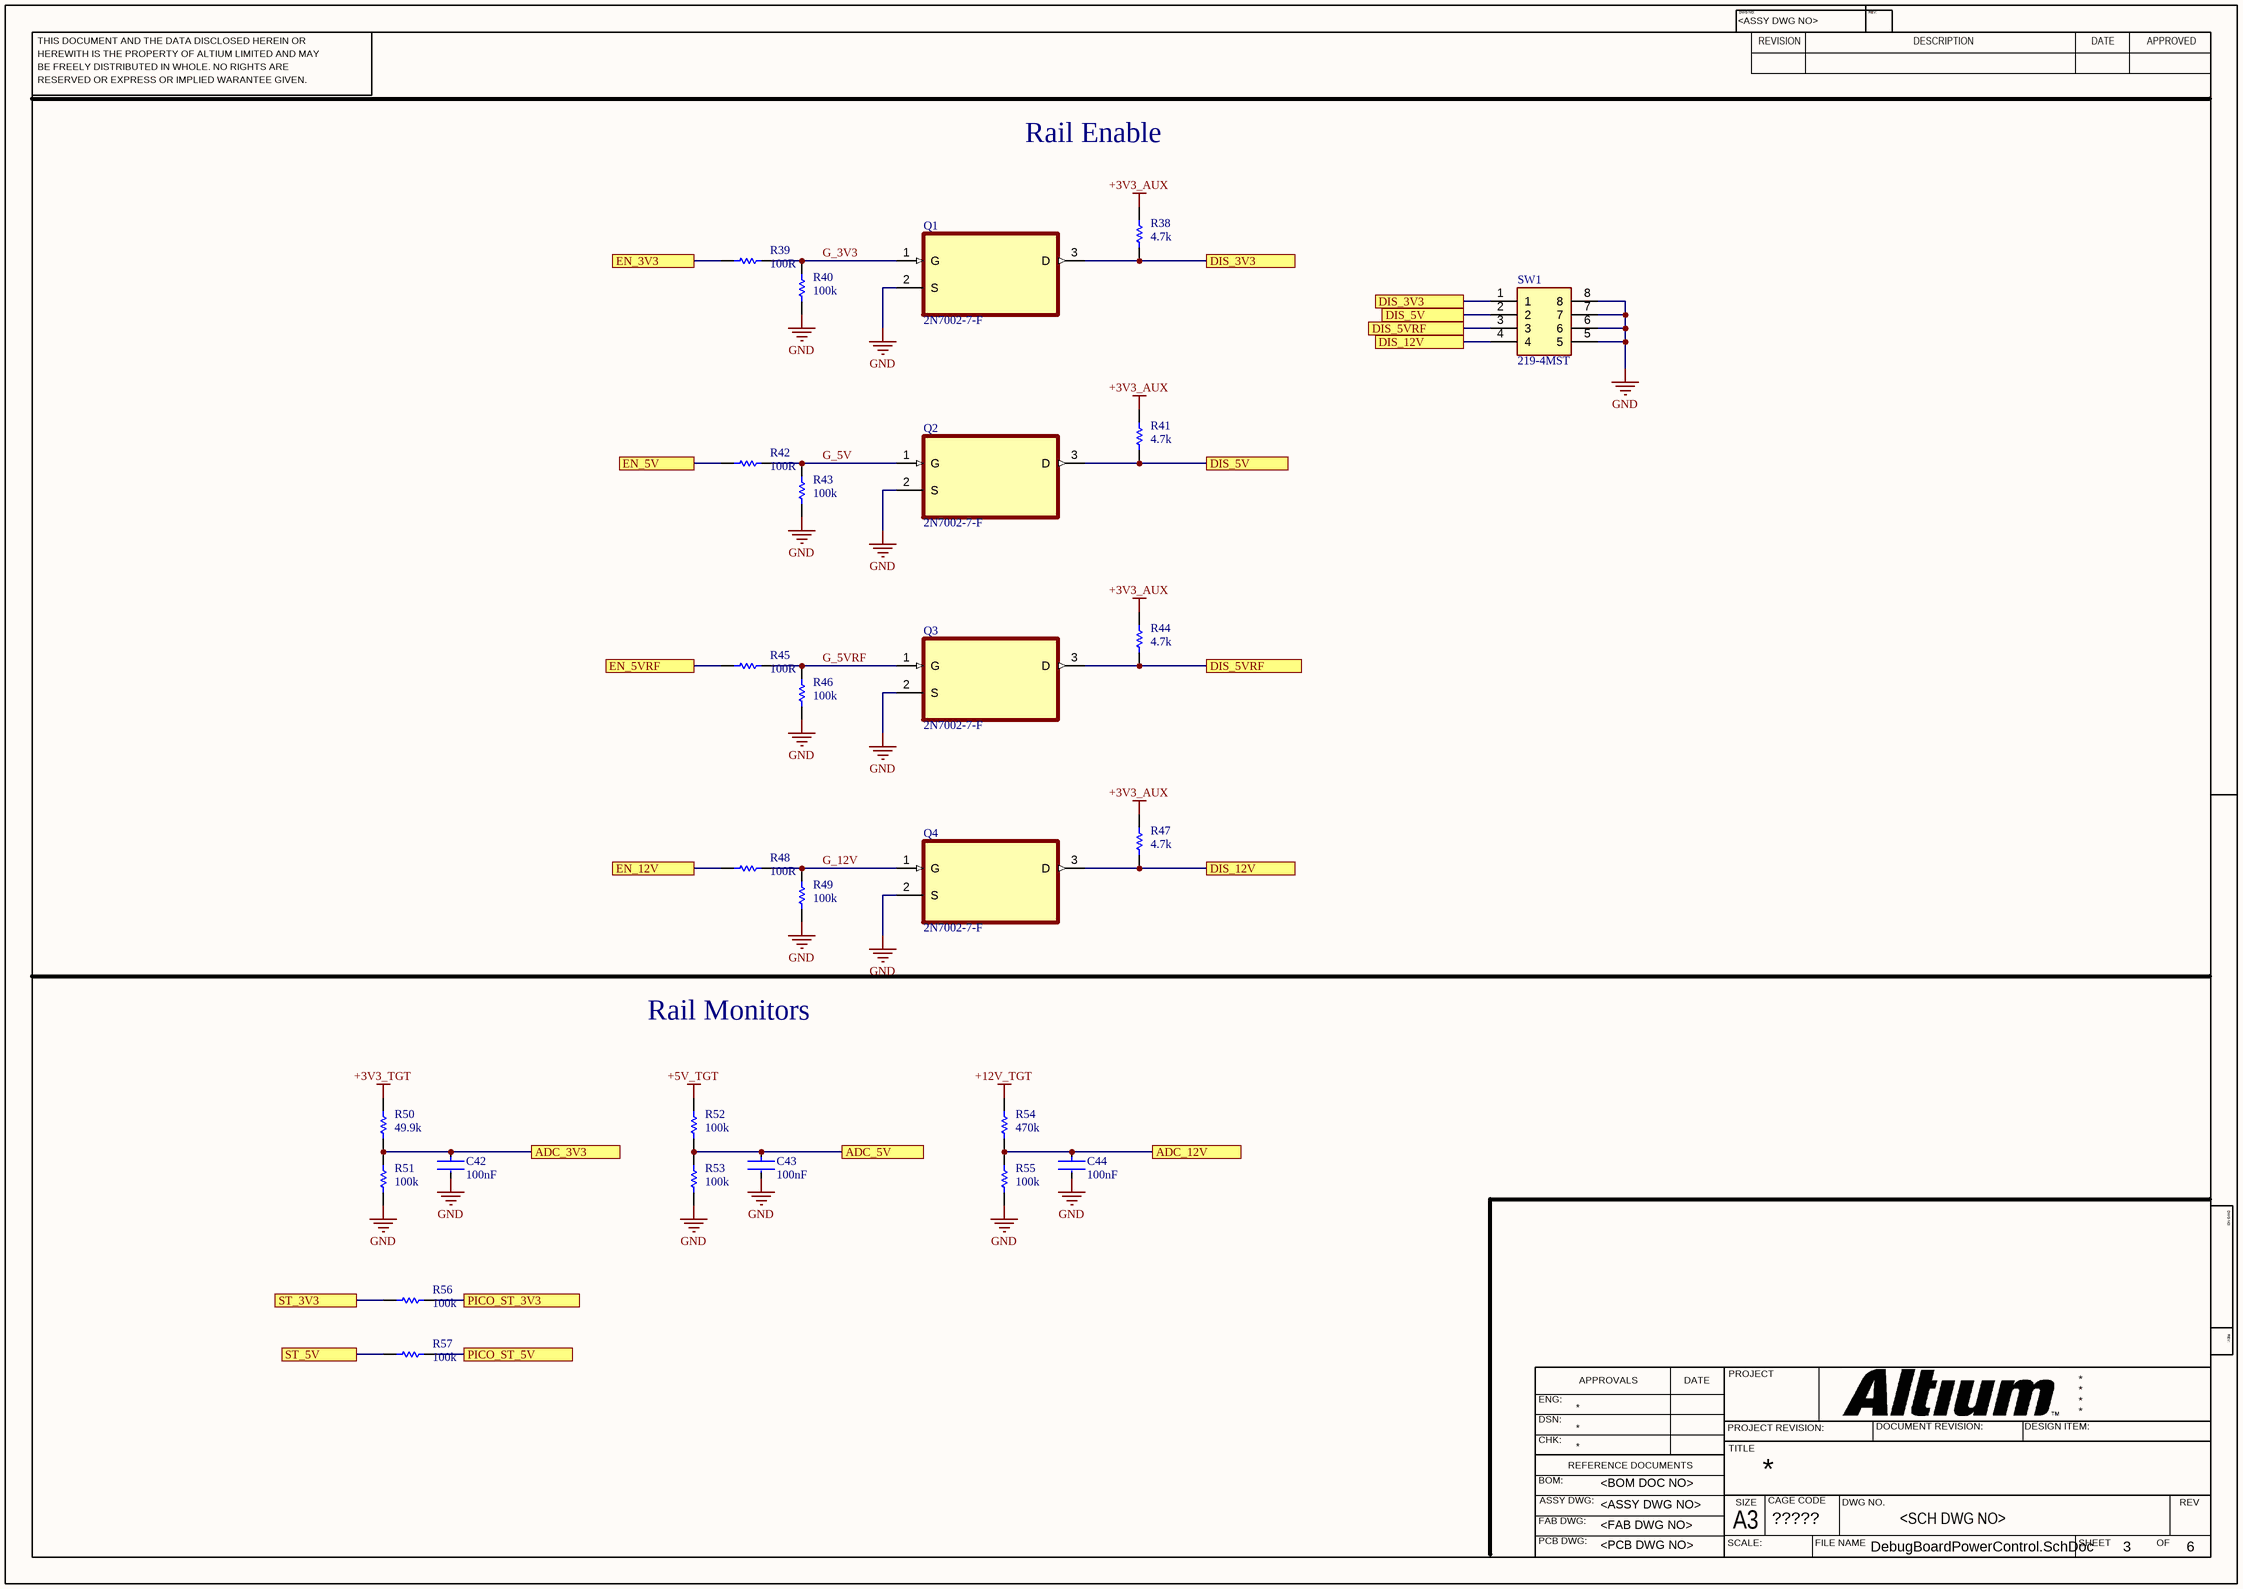
[diagram p2: DebugBoardPowerControl.SchDoc]

### Parts
C42  100nF  [FP-C0805C-DN-MFG]
C43  100nF  [FP-C0805C-DN-MFG]
C44  100nF  [FP-C0805C-DN-MFG]
Q1  2N7002-7-F  [SOT103P240X110-3N]
Q2  2N7002-7-F  [SOT103P240X110-3N]
Q3  2N7002-7-F  [SOT103P240X110-3N]
Q4  2N7002-7-F  [SOT103P240X110-3N]
R38  4.7k  [RES_0805]
R39  100R  [RES_0805]
R40  100k  [RES_0805]
R41  4.7k  [RES_0805]
R42  100R  [RES_0805]
R43  100k  [RES_0805]
R44  4.7k  [RES_0805]
R45  100R  [RES_0805]
R46  100k  [RES_0805]
R47  4.7k  [RES_0805]
R48  100R  [RES_0805]
R49  100k  [RES_0805]
R50  49.9k  [RES_0805]
R51  100k  [RES_0805]
R52  100k  [RES_0805]
R53  100k  [RES_0805]
R54  470k  [RES_0805]
R55  100k  [RES_0805]
R56  100k  [RES_0805]
R57  100k  [RES_0805]
SW1  219-4MST  [2194MST]

### Ports
ADC_3V3, ADC_5V, ADC_12V, DIS_3V3, DIS_5V, DIS_5VRF, DIS_12V, EN_3V3, EN_5V, EN_5VRF, EN_12V, PICO_ST_3V3, PICO_ST_5V, ST_3V3, ST_5V

### Nets
+3V3_AUX: R38.2 R41.2 R44.2 R47.2
+3V3_TGT: R50.1
+5V_TGT: R52.1
+12V_TGT: R54.1
GND: C42.2 C43.2 C44.2 Q1.2(S) Q2.2(S) Q3.2(S) Q4.2(S) R40.2 R43.2 R46.2 R49.2 R51.2 R53.2 R55.2 SW1.5 SW1.6 SW1.7 SW1.8
ADC_3V3: C42.1 R50.2 R51.1 ; port ADC_3V3
ADC_5V: C43.1 R52.2 R53.1 ; port ADC_5V
ADC_12V: C44.1 R54.2 R55.1 ; port ADC_12V
DIS_3V3: Q1.3(D) R38.1 SW1.1 ; port DIS_3V3
DIS_5V: Q2.3(D) R41.1 SW1.2 ; port DIS_5V
DIS_5VRF: Q3.3(D) R44.1 SW1.3 ; port DIS_5VRF
DIS_12V: Q4.3(D) R47.1 SW1.4 ; port DIS_12V
EN_3V3: R39.1 ; port EN_3V3
EN_5V: R42.1 ; port EN_5V
EN_5VRF: R45.1 ; port EN_5VRF
EN_12V: R48.1 ; port EN_12V
G_3V3: Q1.1(G) R39.2 R40.1
G_5V: Q2.1(G) R42.2 R43.1
G_5VRF: Q3.1(G) R45.2 R46.1
G_12V: Q4.1(G) R48.2 R49.1
PICO_ST_3V3: R56.2 ; port PICO_ST_3V3
PICO_ST_5V: R57.2 ; port PICO_ST_5V
ST_3V3: R56.1 ; port ST_3V3
ST_5V: R57.1 ; port ST_5V

### Notes on the sheet
- Rail Enable
- Rail Monitors
- THIS DOCUMENT AND THE DATA DISCLOSED HEREIN OR
- HEREWITH IS THE PROPERTY OF ALTIUM LIMITED AND MAY
- DWG NO:
- REVISION
- REV:
- DESCRIPTION
- DATE
- APPROVED
- BE FREELY DISTRIBUTED IN WHOLE. NO RIGHTS ARE
- RESERVED OR EXPRESS OR IMPLIED WARANTEE GIVEN.
- ENG:
- APPROVALS
- PROJECT
- DSN:
- CHK:
- REFERENCE DOCUMENTS
- PROJECT REVISION:
- TITLE
- DOCUMENT REVISION:
- DESIGN ITEM:
- BOM:
- FAB DWG:
- PCB DWG:
- ASSY DWG:
- SCALE:
- A3
- SIZE
- CAGE CODE
- FILE NAME
- DWG NO.
- SHEET
- OF
- REV

### Library data of the parts
C42-C44 = CMP-03020-000950-1: as C21 on sheet DebugBoard; Voltage Rating: 50 V; Digikey Description: CAP CER 0.1UF 50V X7R 0805; Octopart: https://octopart.com/c0805c104j5ractu-kemet-104634; RoHS: TRUE; Device Class L1: Passive Components; Temperature Characteristic: X7R; Device Class L3: Ceramic Capacitors; Lead Free: Yes; Automotive: No; Category: Cap; Temperature: -55°C to +125°C; Package: C0805C-DN; Temperature Range High: +125°C; Height: 0.88mm; Capacitance: 0.10 μF; Temperature Range Low: -55°C; ComponentLink2Description: Datasheet; ComponentLink2URL: https://content.kemet.com/datasheets/KEM_C1003_C0G_SMD.pdf; Ipc Land Pattern Name: CAPC200125X78; Device Class L2: Capacitors; Mouser Description: Multilayer Ceramic Capacitors MLCC - SMD/SMT 50volts 0.1uF X7R 5%
Q1-Q4 = 2N7002-7-F: N-Channel 60 V 115mA (Ta) 370mW (Ta) Surface Mount SOT-23-3; MF: Diodes Inc.; Purchase-URL: https://pricing.snapeda.com/search/part/2N7002-7-F/?ref=eda; Package: SOT-23-3 Diodes Inc.; MP: 2N7002-7-F; Price: None; Availability: In Stock; Value: 2N7002-7-F; Check_prices: https://www.snapeda.com/parts/2N7002-7-F/Diodes+Inc./view-part/?ref=eda; SnapEDA_Link: https://www.snapeda.com/parts/2N7002-7-F/Diodes+Inc./view-part/?ref=snap
R38-R57 = CMP-009-00183-1: Resistor SMD 0805 - Generic; Source: Generic_Schematic_Library.SchLib; Design Item ID: RES_0805
SW1 = 219-4MST: DIP Switches / SIP Switches; Manufacturer_Name: CTS; Geometry.Height: 4.3mm; Manufacturer_Part_Number: 219-4MST; Mouser Part Number: 774-2194MST; Mouser Price/Stock: https://www.mouser.co.uk/ProductDetail/CTS-Electronic-Components/219-4MST?qs=qNzHFtQhdJ8xGV2Z9mul9A%3D%3D; Arrow Part Number: 219-4MST; Arrow Price/Stock: https://www.arrow.com/en/products/219-4mst/cts; Datasheet Link: https://componentsearchengine.com/Datasheets/1/219-4MST.pdf

## Sheet DebugBoard3V3Mux.SchDoc
size 420 x 297 mm; SheetNumber: 4; SheetTotal: 6
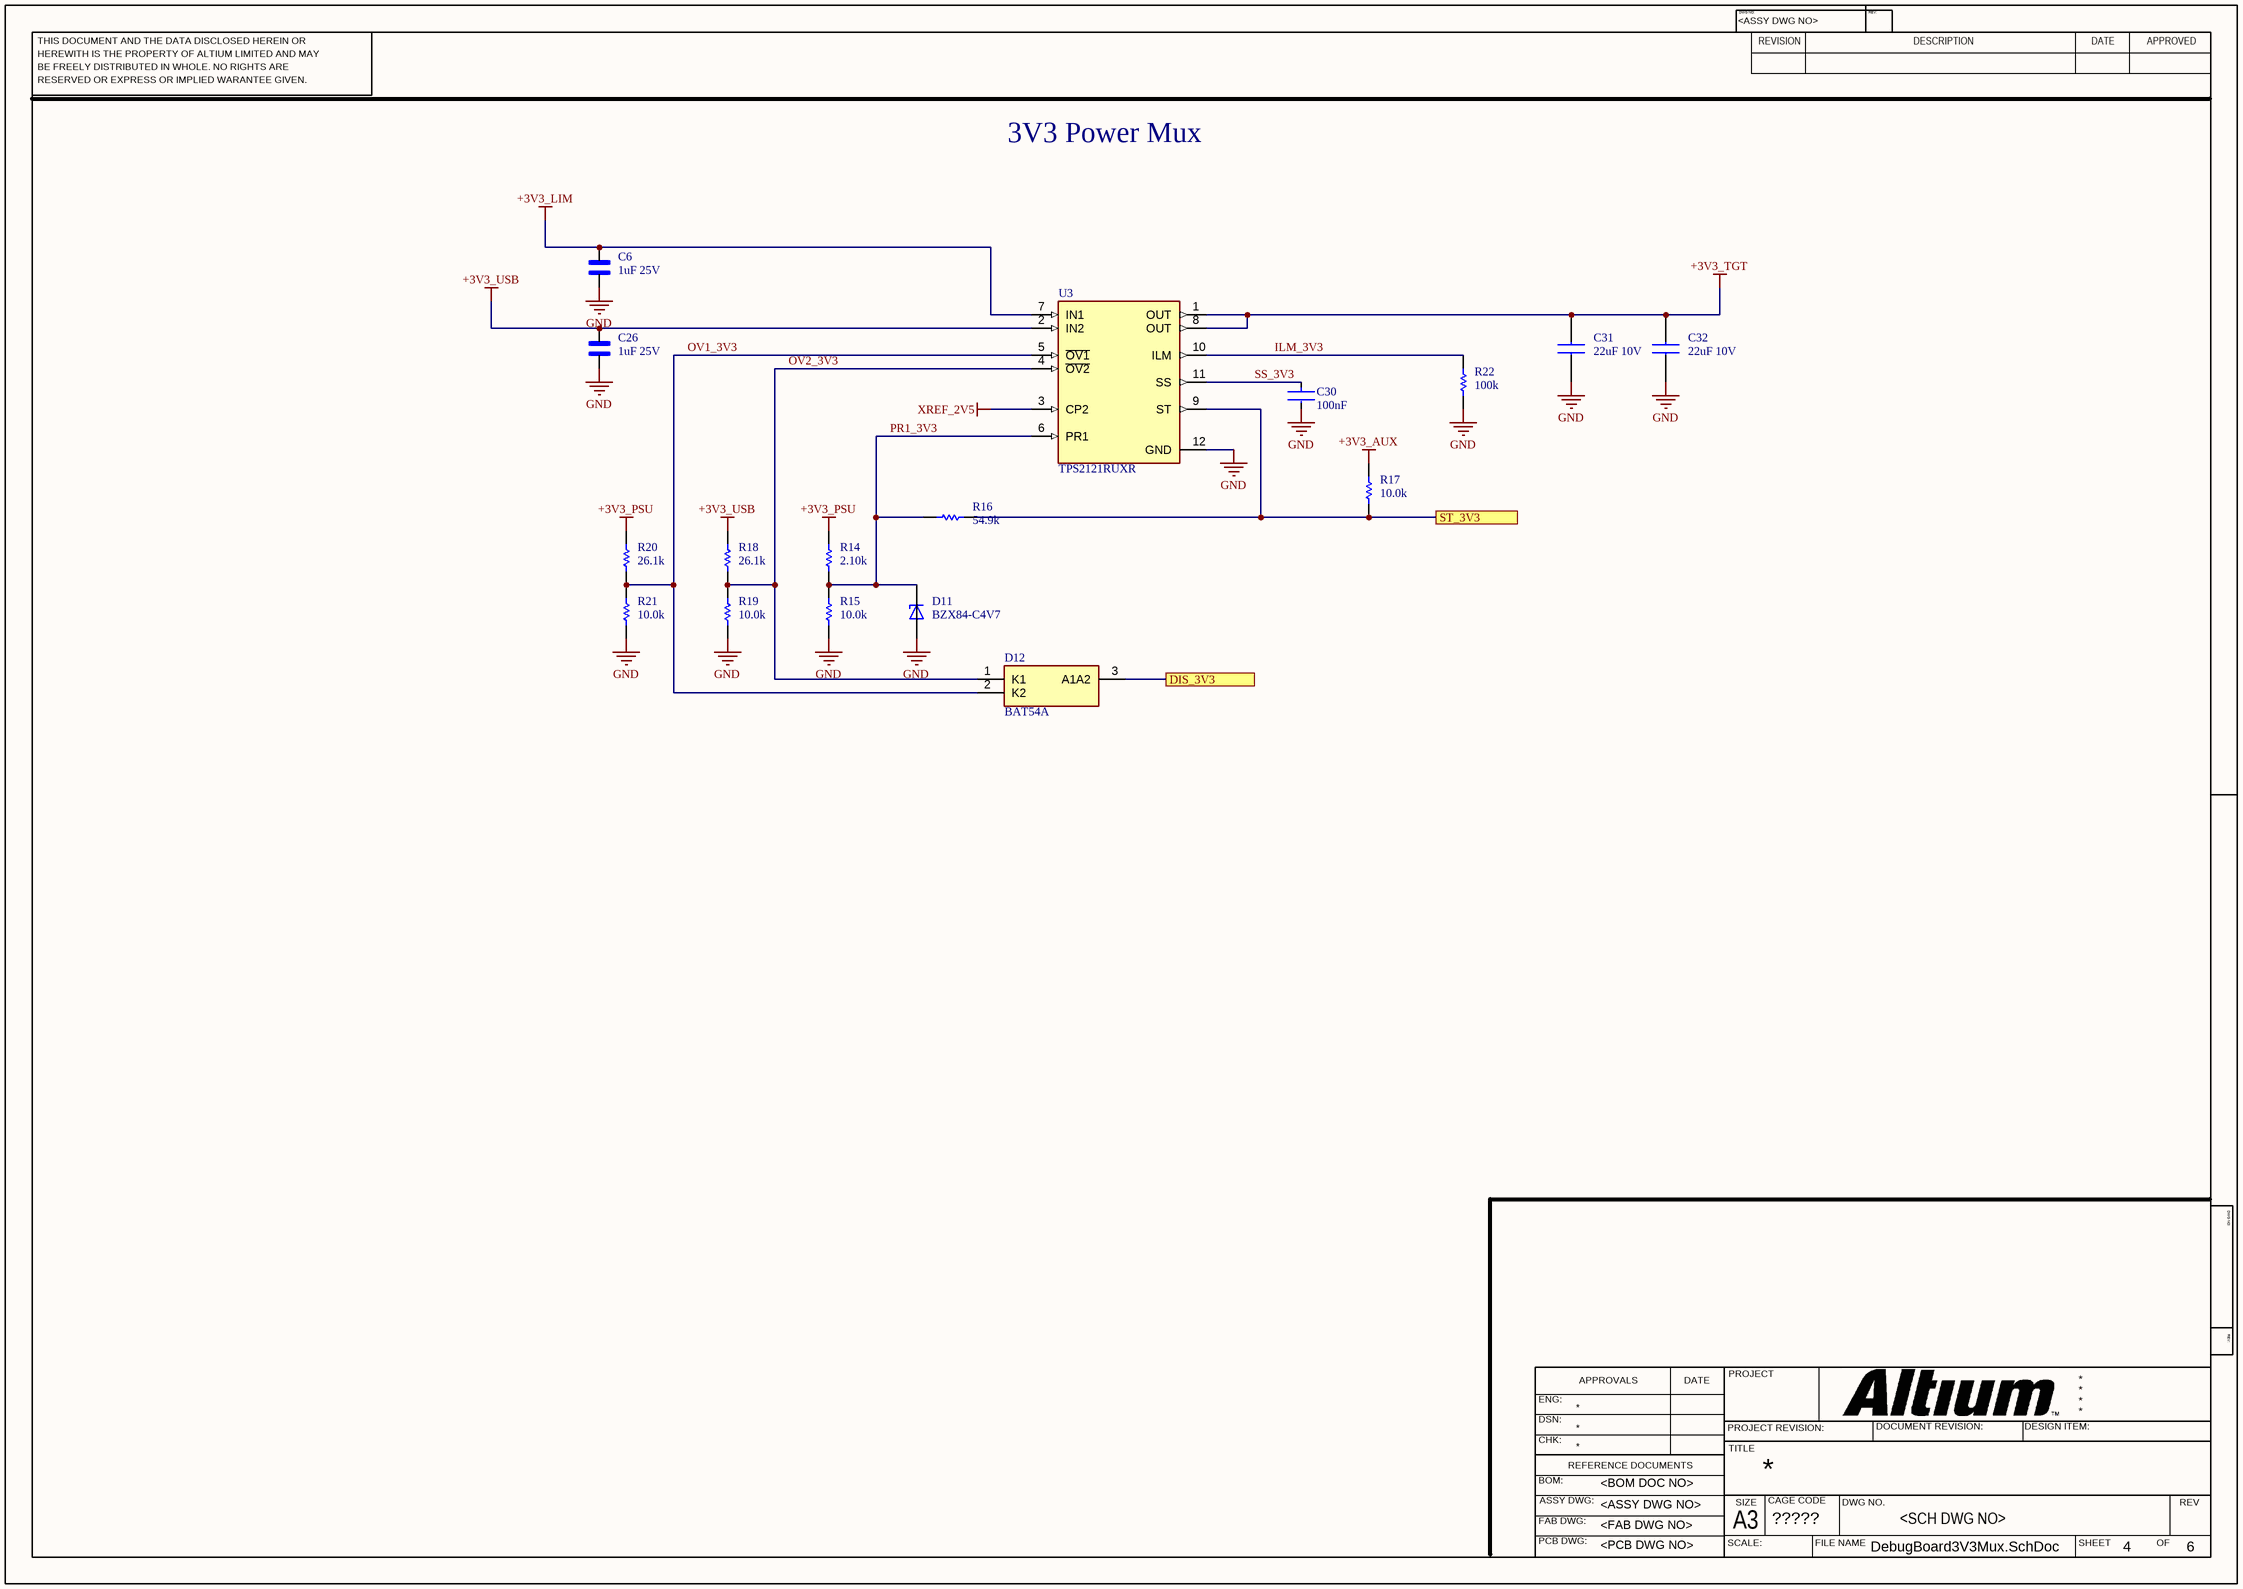
[diagram p3: DebugBoard3V3Mux.SchDoc]

### Parts
C6  1uF 25V  [CAPC2012X135N]
C26  1uF 25V  [CAPC2012X135N]
C30  100nF  [FP-C0805C-DN-MFG]
C31  22uF 10V  [CAPC3116X180N]
C32  22uF 10V  [CAPC3116X180N]
D11  BZX84-C4V7  [SOT95P230X110-3N]
D12  BAT54A  [SOT95P230X110-3N]
R14  2.10k  [RES_0805]
R15  10.0k  [RES_0805]
R16  54.9k  [RES_0805]
R17  10.0k  [RES_0805]
R18  26.1k  [RES_0805]
R19  10.0k  [RES_0805]
R20  26.1k  [RES_0805]
R21  10.0k  [RES_0805]
R22  100k  [RES_0805]
U3  TPS2121RUXR  [FP-RUX0012A-MFG]

### Ports
DIS_3V3, ST_3V3

### Nets
+3V3_AUX: R17.2
+3V3_LIM: C6.1 U3.7(IN1)
+3V3_PSU: R14.1 R20.1
+3V3_TGT: C31.1 C32.1 U3.1(OUT) U3.8(OUT)
+3V3_USB: C26.1 R18.1 U3.2(IN2)
GND: C6.2 C26.2 C30.2 C31.2 C32.2 D11.1(A) R15.2 R19.2 R21.2 R22.2 U3.12(GND)
XREF_2V5: U3.3(CP2)
DIS_3V3: D12.3(A1A2) ; port DIS_3V3
ILM_3V3: R22.1 U3.10(ILM)
OV1_3V3: D12.2(K2) R20.2 R21.1 U3.5(~{OV1})
OV2_3V3: D12.1(K1) R18.2 R19.1 U3.4(~{OV2})
PR1_3V3: D11.3(C) R14.2 R15.1 R16.1 U3.6(PR1)
SS_3V3: C30.1 U3.11(SS)
ST_3V3: R16.2 R17.1 U3.9(ST) ; port ST_3V3

### Notes on the sheet
- 3V3 Power Mux
- THIS DOCUMENT AND THE DATA DISCLOSED HEREIN OR
- HEREWITH IS THE PROPERTY OF ALTIUM LIMITED AND MAY
- DWG NO:
- REVISION
- REV:
- DESCRIPTION
- DATE
- APPROVED
- BE FREELY DISTRIBUTED IN WHOLE. NO RIGHTS ARE
- RESERVED OR EXPRESS OR IMPLIED WARANTEE GIVEN.
- ENG:
- APPROVALS
- PROJECT
- DSN:
- CHK:
- REFERENCE DOCUMENTS
- PROJECT REVISION:
- TITLE
- DOCUMENT REVISION:
- DESIGN ITEM:
- BOM:
- FAB DWG:
- PCB DWG:
- ASSY DWG:
- SCALE:
- A3
- SIZE
- CAGE CODE
- FILE NAME
- DWG NO.
- SHEET
- OF
- REV

### Library data of the parts
C6 C26 = CL21B105KAFNNNE: as C24 on sheet DebugBoardMuxes; SnapEDA_Link: https://www.snapeda.com/parts/CL21B105KAFNNNE/Samsung/view-part/?ref=snap; Package: SMD-2 Samsung; Value: 1uF 25V; MP: CL21B105KAFNNNE; Check_prices: https://www.snapeda.com/parts/CL21B105KAFNNNE/Samsung/view-part/?ref=eda
C30 = CMP-03020-000950-1: as C21 on sheet DebugBoard; Voltage Rating: 50 V; Digikey Description: CAP CER 0.1UF 50V X7R 0805; Octopart: https://octopart.com/c0805c104j5ractu-kemet-104634; RoHS: TRUE; Device Class L1: Passive Components; Temperature Characteristic: X7R; Device Class L3: Ceramic Capacitors; Lead Free: Yes; Automotive: No; Category: Cap; Temperature: -55°C to +125°C; Package: C0805C-DN; Temperature Range High: +125°C; Height: 0.88mm; Capacitance: 0.10 μF; Temperature Range Low: -55°C; ComponentLink2Description: Datasheet; ComponentLink2URL: https://content.kemet.com/datasheets/KEM_C1003_C0G_SMD.pdf; Ipc Land Pattern Name: CAPC200125X78; Device Class L2: Capacitors; Mouser Description: Multilayer Ceramic Capacitors MLCC - SMD/SMT 50volts 0.1uF X7R 5%
C31 C32 = GCM31CR71A226KE02K: as C37 on sheet DebugBoardMuxes; Manufacturer_Part_Number: GCM31CR71A226KE02K; Mouser Part Number: 81-GCM31CR71A226KE2K; Mouser Price/Stock: https://www.mouser.co.uk/ProductDetail/Murata-Electronics/GCM31CR71A226KE02K?qs=QzBtWTOodeVgM6QlH6X51g%3D%3D; Arrow Part Number: GCM31CR71A226KE02K; Arrow Price/Stock: https://www.arrow.com/en/products/gcm31cr71a226ke02k/murata-manufacturing?region=nac; Datasheet Link: https://search.murata.co.jp/Ceramy/image/img/A01X/G101/ENG/GCM31CR71A226KE02-01A.pdf
D11 = BZX84-C4V7,215: MF: {'manufacturer': u'Nexperia USA Inc.'}; Package: None; Price: None; Value: BZX84-C4V7; MP: BZX84-C4V7,215; Availability: Unavailable
D12 = BAT54A_215: as D15 on sheet DebugBoardMuxes; Mouser Part Number: 771-BAT54A-T/R; Mouser Price/Stock: https://www.mouser.co.uk/ProductDetail/Nexperia/BAT54A215?qs=me8TqzrmIYV%252BITv%2F8aeieg%3D%3D; Arrow Part Number: BAT54A,215; Arrow Price/Stock: https://www.arrow.com/en/products/bat54a215/nexperia.html?utm_currency=USD&region=europe; Datasheet Link: https://assets.nexperia.com/documents/data-sheet/BAT54A.pdf
R14-R22 = CMP-009-00183-1: Resistor SMD 0805 - Generic; Source: Generic_Schematic_Library.SchLib; Design Item ID: RES_0805
U3 = CMP-019-00076-1: as U7 on sheet DebugBoardMuxes; Max Operating Temperature: 125°C; Output Voltage: 22V; Pins: 12; Min Operating Temperature: -40°C

## Sheet DebugBoard5VMux.SchDoc
size 420 x 297 mm; SheetNumber: 2; SheetTotal: 2
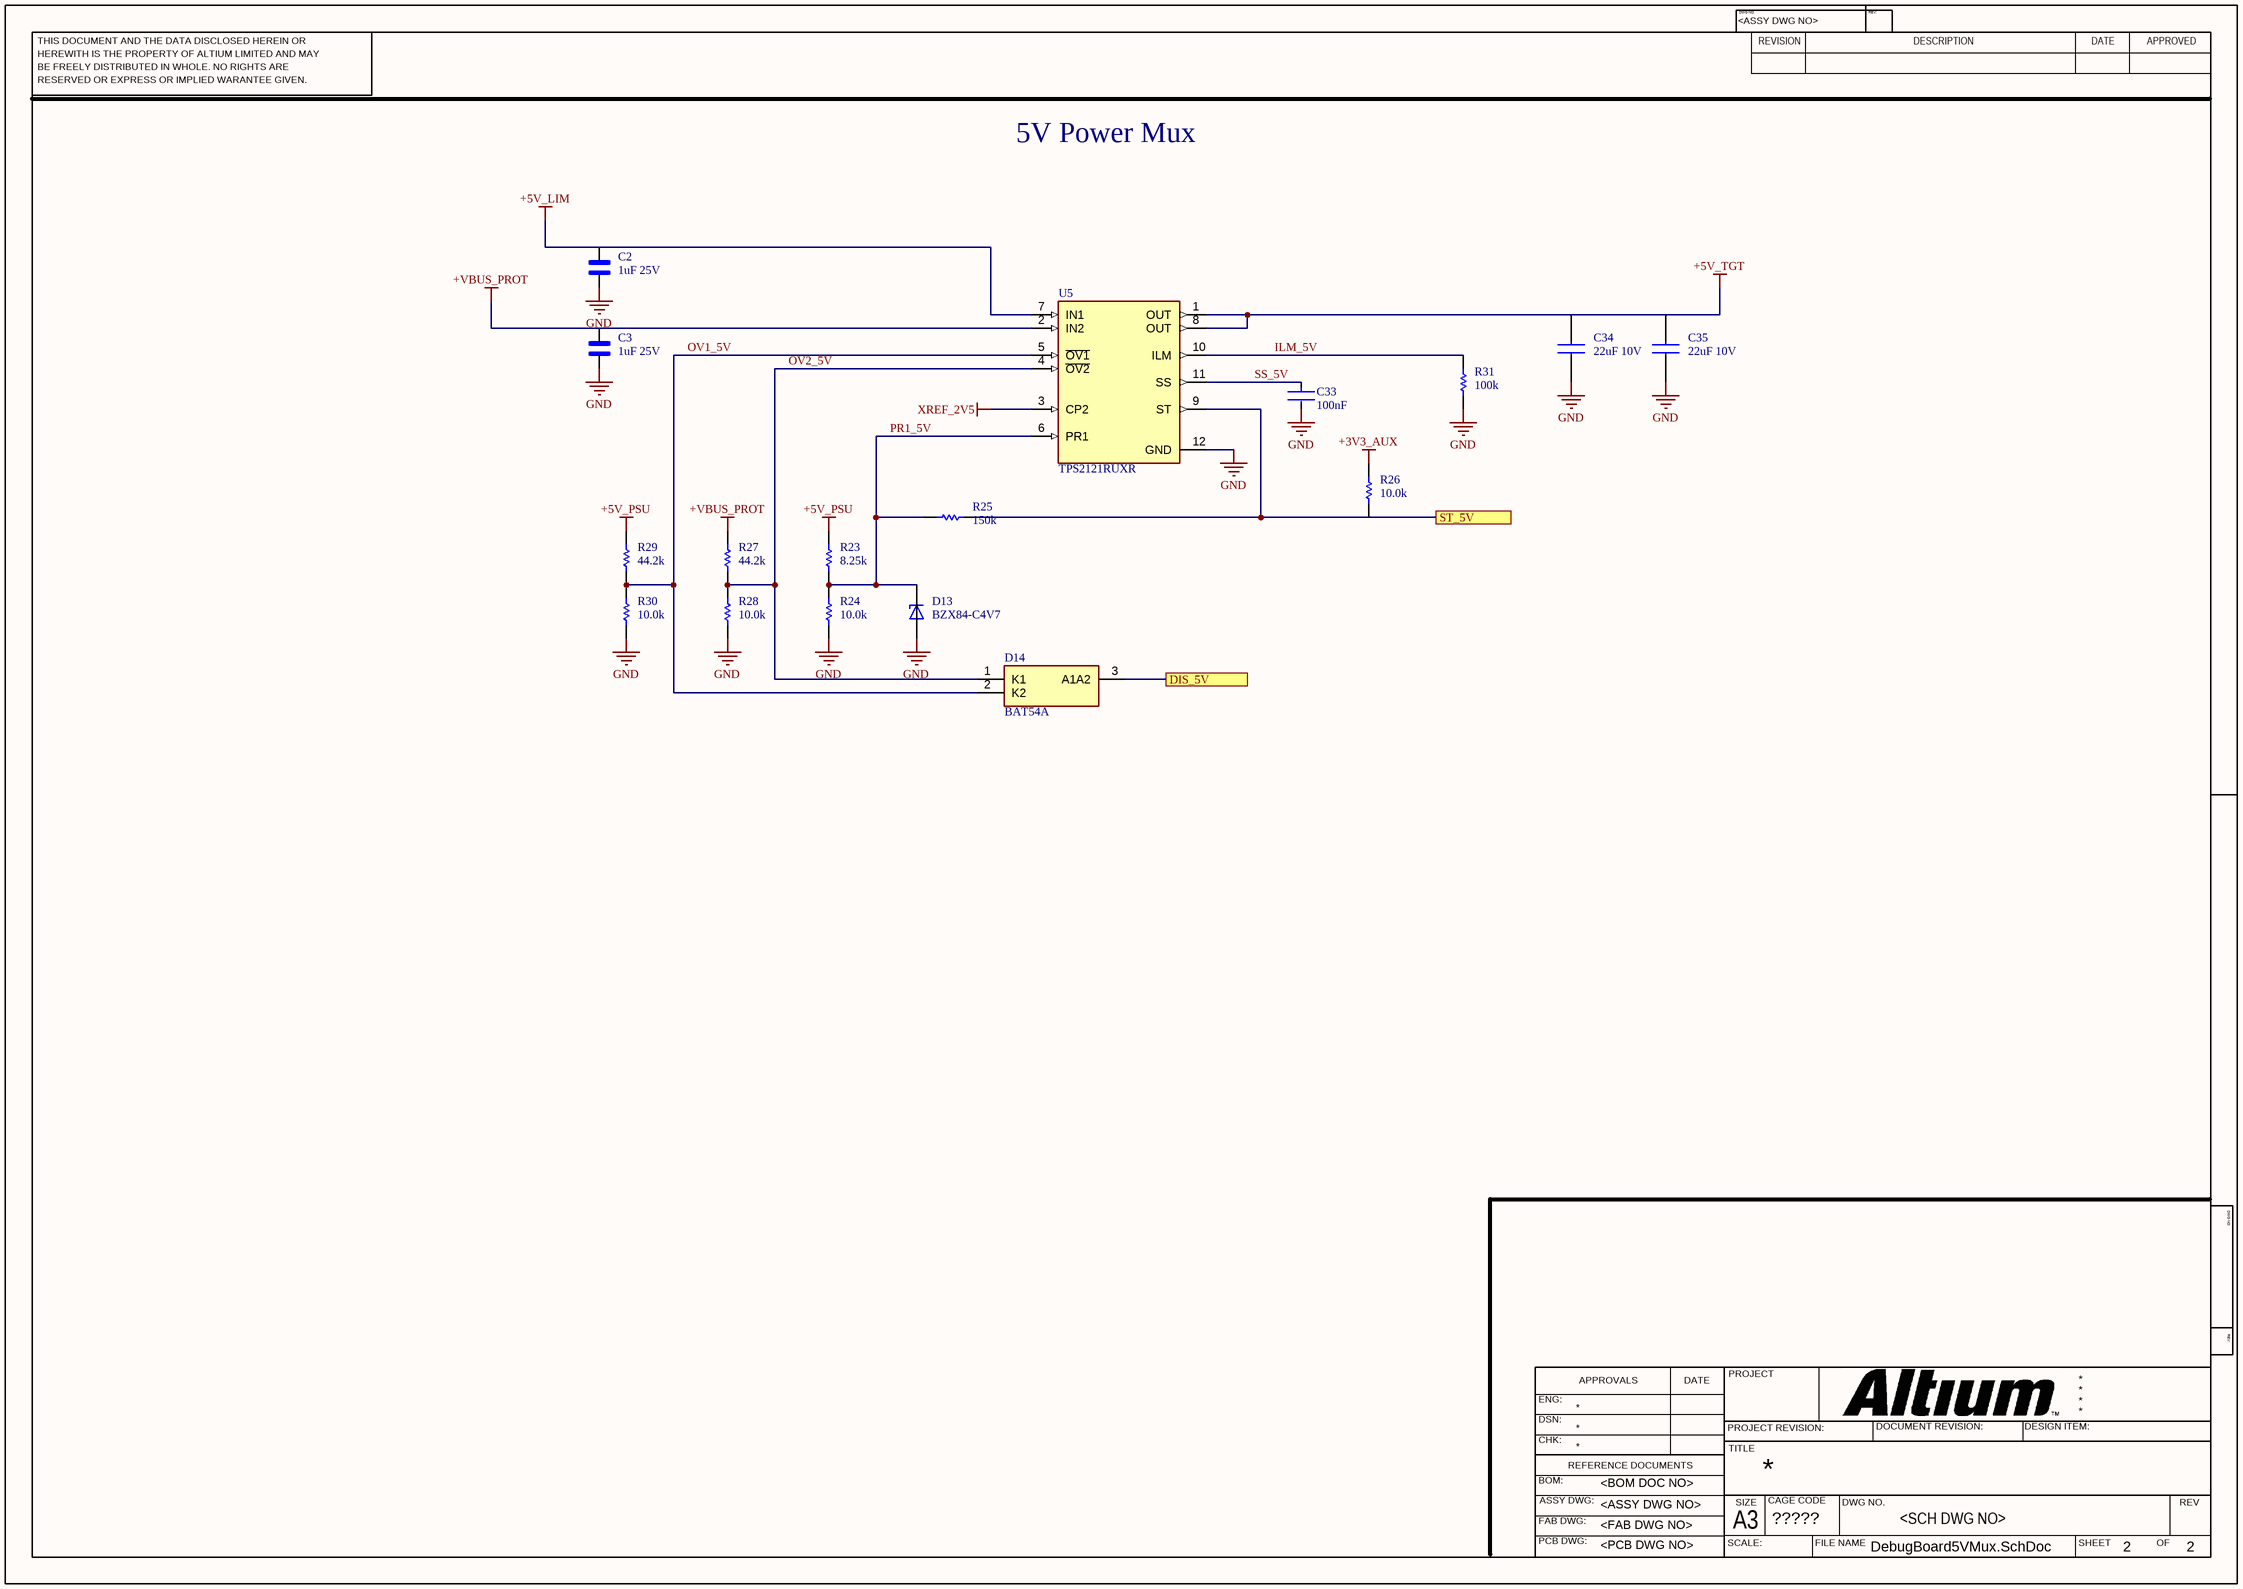
[diagram p4: DebugBoard5VMux.SchDoc]

### Parts
C2  1uF 25V  [CAPC2012X135N]
C3  1uF 25V  [CAPC2012X135N]
C33  100nF  [FP-C0805C-DN-MFG]
C34  22uF 10V  [CAPC3116X180N]
C35  22uF 10V  [CAPC3116X180N]
D13  BZX84-C4V7  [SOT95P230X110-3N]
D14  BAT54A  [SOT95P230X110-3N]
R23  8.25k  [RES_0805]
R24  10.0k  [RES_0805]
R25  150k  [RES_0805]
R26  10.0k  [RES_0805]
R27  44.2k  [RES_0805]
R28  10.0k  [RES_0805]
R29  44.2k  [RES_0805]
R30  10.0k  [RES_0805]
R31  100k  [RES_0805]
U5  TPS2121RUXR  [FP-RUX0012A-MFG]

### Ports
DIS_5V, ST_5V

### Nets
+3V3_AUX: R26.2
+5V_LIM: C2.1 U5.7(IN1)
+5V_PSU: R23.1 R29.1
+5V_TGT: C34.1 C35.1 U5.1(OUT) U5.8(OUT)
+VBUS_PROT: C3.1 R27.1 U5.2(IN2)
GND: C2.2 C3.2 C33.2 C34.2 C35.2 D13.1(A) R24.2 R28.2 R30.2 R31.2 U5.12(GND)
XREF_2V5: U5.3(CP2)
DIS_5V: D14.3(A1A2) ; port DIS_5V
ILM_5V: R31.1 U5.10(ILM)
OV1_5V: D14.2(K2) R29.2 R30.1 U5.5(~{OV1})
OV2_5V: D14.1(K1) R27.2 R28.1 U5.4(~{OV2})
PR1_5V: D13.3(C) R23.2 R24.1 R25.1 U5.6(PR1)
SS_5V: C33.1 U5.11(SS)
ST_5V: R25.2 R26.1 U5.9(ST) ; port ST_5V

### Notes on the sheet
- 5V Power Mux
- THIS DOCUMENT AND THE DATA DISCLOSED HEREIN OR
- HEREWITH IS THE PROPERTY OF ALTIUM LIMITED AND MAY
- DWG NO:
- REVISION
- REV:
- DESCRIPTION
- DATE
- APPROVED
- BE FREELY DISTRIBUTED IN WHOLE. NO RIGHTS ARE
- RESERVED OR EXPRESS OR IMPLIED WARANTEE GIVEN.
- ENG:
- APPROVALS
- PROJECT
- DSN:
- CHK:
- REFERENCE DOCUMENTS
- PROJECT REVISION:
- TITLE
- DOCUMENT REVISION:
- DESIGN ITEM:
- BOM:
- FAB DWG:
- PCB DWG:
- ASSY DWG:
- SCALE:
- A3
- SIZE
- CAGE CODE
- FILE NAME
- DWG NO.
- SHEET
- OF
- REV

### Library data of the parts
C2 C3 = CL21B105KAFNNNE: as C24 on sheet DebugBoardMuxes; SnapEDA_Link: https://www.snapeda.com/parts/CL21B105KAFNNNE/Samsung/view-part/?ref=snap; Package: SMD-2 Samsung; Value: 1uF 25V; MP: CL21B105KAFNNNE; Check_prices: https://www.snapeda.com/parts/CL21B105KAFNNNE/Samsung/view-part/?ref=eda
C33 = CMP-03020-000950-1: as C21 on sheet DebugBoard; Voltage Rating: 50 V; Digikey Description: CAP CER 0.1UF 50V X7R 0805; Octopart: https://octopart.com/c0805c104j5ractu-kemet-104634; RoHS: TRUE; Device Class L1: Passive Components; Temperature Characteristic: X7R; Device Class L3: Ceramic Capacitors; Lead Free: Yes; Automotive: No; Category: Cap; Temperature: -55°C to +125°C; Package: C0805C-DN; Temperature Range High: +125°C; Height: 0.88mm; Capacitance: 0.10 μF; Temperature Range Low: -55°C; ComponentLink2Description: Datasheet; ComponentLink2URL: https://content.kemet.com/datasheets/KEM_C1003_C0G_SMD.pdf; Ipc Land Pattern Name: CAPC200125X78; Device Class L2: Capacitors; Mouser Description: Multilayer Ceramic Capacitors MLCC - SMD/SMT 50volts 0.1uF X7R 5%
C34 C35 = GCM31CR71A226KE02K: as C37 on sheet DebugBoardMuxes; Manufacturer_Part_Number: GCM31CR71A226KE02K; Mouser Part Number: 81-GCM31CR71A226KE2K; Mouser Price/Stock: https://www.mouser.co.uk/ProductDetail/Murata-Electronics/GCM31CR71A226KE02K?qs=QzBtWTOodeVgM6QlH6X51g%3D%3D; Arrow Part Number: GCM31CR71A226KE02K; Arrow Price/Stock: https://www.arrow.com/en/products/gcm31cr71a226ke02k/murata-manufacturing?region=nac; Datasheet Link: https://search.murata.co.jp/Ceramy/image/img/A01X/G101/ENG/GCM31CR71A226KE02-01A.pdf
D13 = BZX84-C4V7,215: as D11 on sheet DebugBoard3V3Mux; Package: None; Price: None; Value: BZX84-C4V7; MP: BZX84-C4V7,215; Availability: Unavailable
D14 = BAT54A_215: as D15 on sheet DebugBoardMuxes; Mouser Part Number: 771-BAT54A-T/R; Mouser Price/Stock: https://www.mouser.co.uk/ProductDetail/Nexperia/BAT54A215?qs=me8TqzrmIYV%252BITv%2F8aeieg%3D%3D; Arrow Part Number: BAT54A,215; Arrow Price/Stock: https://www.arrow.com/en/products/bat54a215/nexperia.html?utm_currency=USD&region=europe; Datasheet Link: https://assets.nexperia.com/documents/data-sheet/BAT54A.pdf
R23-R31 = CMP-009-00183-1: Resistor SMD 0805 - Generic; Source: Generic_Schematic_Library.SchLib; Design Item ID: RES_0805
U5 = CMP-019-00076-1: as U7 on sheet DebugBoardMuxes; Max Operating Temperature: 125°C; Output Voltage: 22V; Pins: 12; Min Operating Temperature: -40°C

## Sheet DebugBoardLimiters.SchDoc
size 420 x 297 mm; SheetNumber: 6; SheetTotal: 6
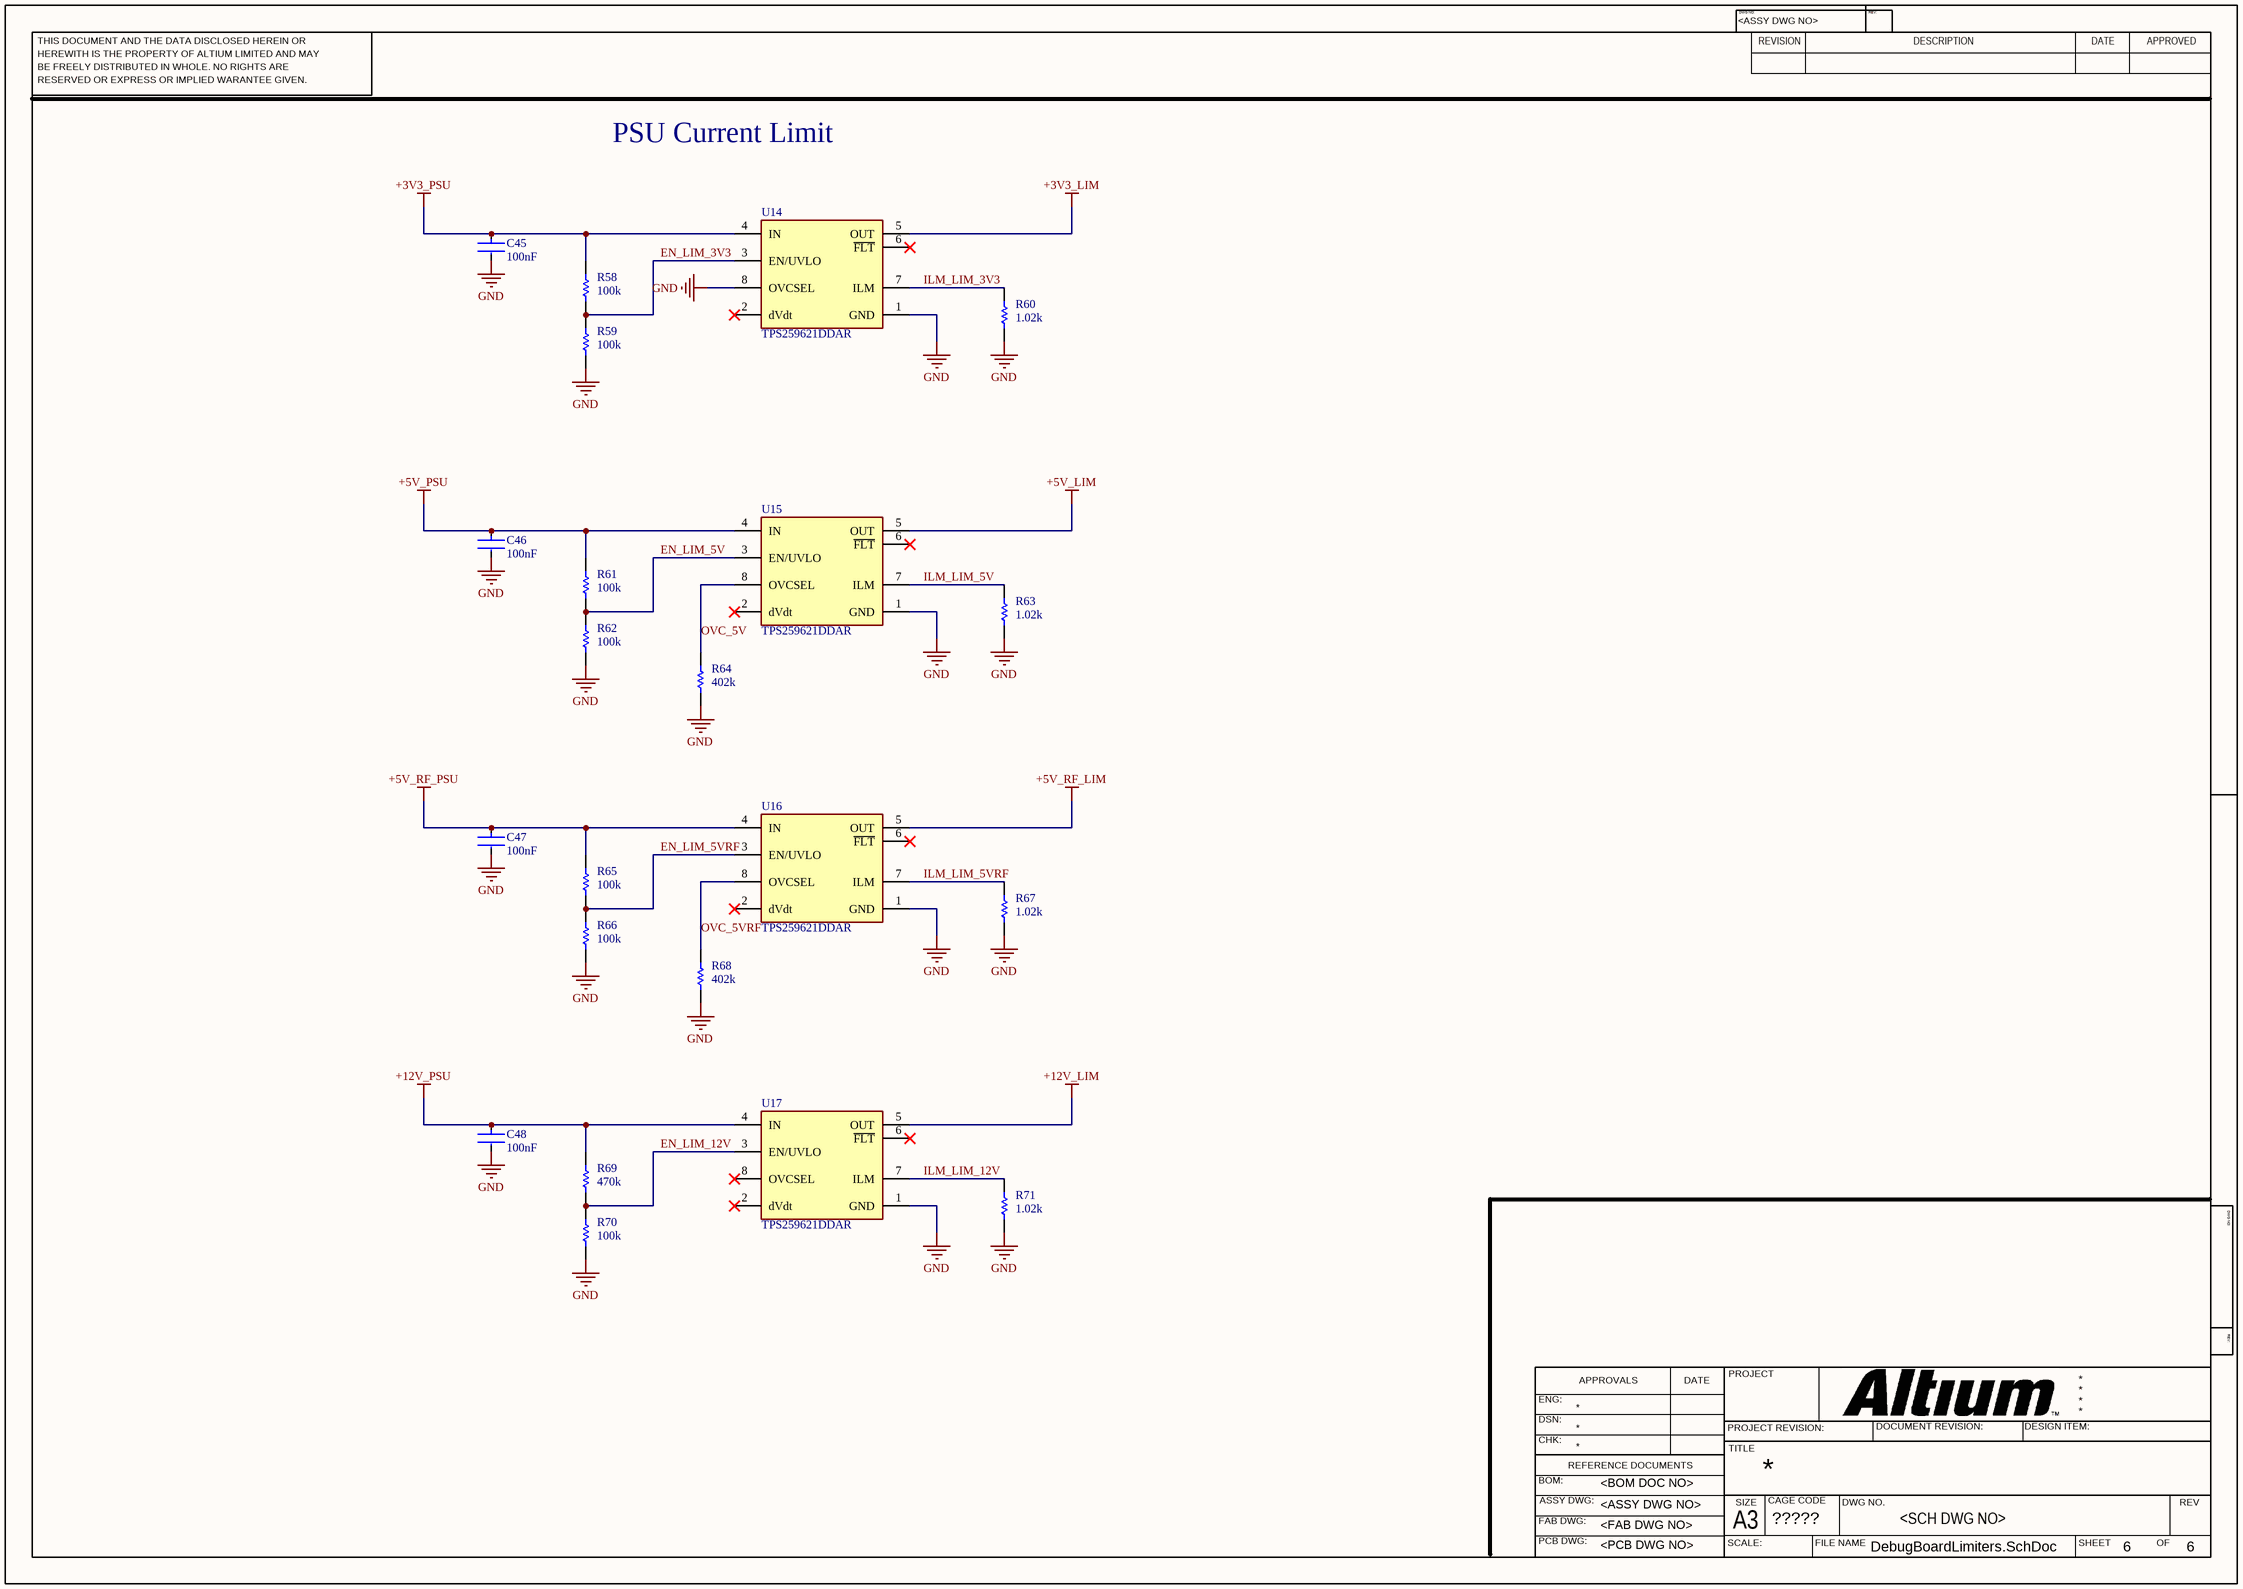
[diagram p5: DebugBoardLimiters.SchDoc]

### Parts
C45  100nF  [FP-C0805C-DN-MFG]
C46  100nF  [FP-C0805C-DN-MFG]
C47  100nF  [FP-C0805C-DN-MFG]
C48  100nF  [FP-C0805C-DN-MFG]
R58  100k  [RES_0805]
R59  100k  [RES_0805]
R60  1.02k  [RES_0805]
R61  100k  [RES_0805]
R62  100k  [RES_0805]
R63  1.02k  [RES_0805]
R64  402k  [RES_0805]
R65  100k  [RES_0805]
R66  100k  [RES_0805]
R67  1.02k  [RES_0805]
R68  402k  [RES_0805]
R69  470k  [RES_0805]
R70  100k  [RES_0805]
R71  1.02k  [RES_0805]
U14  TPS259621DDAR  [SOIC127P600X170-9N]
U15  TPS259621DDAR  [SOIC127P600X170-9N]
U16  TPS259621DDAR  [SOIC127P600X170-9N]
U17  TPS259621DDAR  [SOIC127P600X170-9N]

### Nets
+3V3_LIM: U14.5(OUT)
+3V3_PSU: C45.1 R58.1 U14.4(IN)
+5V_LIM: U15.5(OUT)
+5V_PSU: C46.1 R61.1 U15.4(IN)
+5V_RF_LIM: U16.5(OUT)
+5V_RF_PSU: C47.1 R65.1 U16.4(IN)
+12V_LIM: U17.5(OUT)
+12V_PSU: C48.1 R69.1 U17.4(IN)
GND: C45.2 C46.2 C47.2 C48.2 R59.2 R60.2 R62.2 R63.2 R64.2 R66.2 R67.2 R68.2 R70.2 R71.2 U14.1(GND) U14.8(OVCSEL) U15.1(GND) U16.1(GND) U17.1(GND)
EN_LIM_3V3: R58.2 R59.1 U14.3(EN/UVLO)
EN_LIM_5V: R61.2 R62.1 U15.3(EN/UVLO)
EN_LIM_5VRF: R65.2 R66.1 U16.3(EN/UVLO)
EN_LIM_12V: R69.2 R70.1 U17.3(EN/UVLO)
ILM_LIM_3V3: R60.1 U14.7(ILM)
ILM_LIM_5V: R63.1 U15.7(ILM)
ILM_LIM_5VRF: R67.1 U16.7(ILM)
ILM_LIM_12V: R71.1 U17.7(ILM)
OVC_5V: R64.1 U15.8(OVCSEL)
OVC_5VRF: R68.1 U16.8(OVCSEL)

Not connected (* = marked no-connect by the designer): U14 2(dVdt)* 6(~{FLT})*; U15 2(dVdt)* 6(~{FLT})*; U16 2(dVdt)* 6(~{FLT})*; U17 2(dVdt)* 6(~{FLT})* 8(OVCSEL)*

### Notes on the sheet
- PSU Current Limit
- THIS DOCUMENT AND THE DATA DISCLOSED HEREIN OR
- HEREWITH IS THE PROPERTY OF ALTIUM LIMITED AND MAY
- DWG NO:
- REVISION
- REV:
- DESCRIPTION
- DATE
- APPROVED
- BE FREELY DISTRIBUTED IN WHOLE. NO RIGHTS ARE
- RESERVED OR EXPRESS OR IMPLIED WARANTEE GIVEN.
- ENG:
- APPROVALS
- PROJECT
- DSN:
- CHK:
- REFERENCE DOCUMENTS
- PROJECT REVISION:
- TITLE
- DOCUMENT REVISION:
- DESIGN ITEM:
- BOM:
- FAB DWG:
- PCB DWG:
- ASSY DWG:
- SCALE:
- A3
- SIZE
- CAGE CODE
- FILE NAME
- DWG NO.
- SHEET
- OF
- REV

### Library data of the parts
C45-C48 = CMP-03020-000950-1: as C21 on sheet DebugBoard; Voltage Rating: 50 V; Digikey Description: CAP CER 0.1UF 50V X7R 0805; Octopart: https://octopart.com/c0805c104j5ractu-kemet-104634; RoHS: TRUE; Device Class L1: Passive Components; Temperature Characteristic: X7R; Device Class L3: Ceramic Capacitors; Lead Free: Yes; Automotive: No; Category: Cap; Temperature: -55°C to +125°C; Package: C0805C-DN; Temperature Range High: +125°C; Height: 0.88mm; Capacitance: 0.10 μF; Temperature Range Low: -55°C; ComponentLink2Description: Datasheet; ComponentLink2URL: https://content.kemet.com/datasheets/KEM_C1003_C0G_SMD.pdf; Ipc Land Pattern Name: CAPC200125X78; Device Class L2: Capacitors; Mouser Description: Multilayer Ceramic Capacitors MLCC - SMD/SMT 50volts 0.1uF X7R 5%
R58-R71 = CMP-009-00183-1: Resistor SMD 0805 - Generic; Source: Generic_Schematic_Library.SchLib; Design Item ID: RES_0805
U14-U17 = TPS259621DDAR: eFuse, 2.7-19 V, 0.125-2 A adjustable current limit, 89 mOhm, OV clamp, auto-retry, HSOIC-8; Manufacturer: Texas Instruments; Current Rating: 2A; Max Supply Voltage: 19V; On-State Resistance: 120mΩ; Value: 120mΩ; Min Supply Voltage: 2.7V; Case/Package: HSOIC-8 (DDA); Datasheet: https://www.ti.com/lit/ds/symlink/tps2596.pdf; Pins: 8; Height: 1.7mm; Manufacturer Part Number: TPS259621DDAR

## Nets that join several sheets
+3V3_AUX: DebugBoardMuxes (C28.1 R13.1 U9.3), DebugBoardPowerControl (R38.2 R41.2 R44.2 R47.2), DebugBoard3V3Mux (R17.2), DebugBoard5VMux (R26.2)
+3V3_LIM: DebugBoard3V3Mux (C6.1 U3.7), DebugBoardLimiters (U14.5)
+3V3_PSU: DebugBoard (TP3.1), DebugBoardMuxes (D4.C D8.1), DebugBoard3V3Mux (R14.1 R20.1), DebugBoardLimiters (C45.1 R58.1 U14.4)
+3V3_TGT: DebugBoard (J1.1 P3.1), DebugBoardPowerControl (R50.1), DebugBoard3V3Mux (C31.1 C32.1 U3.1 U3.8)
+3V3_USB: DebugBoard (C19.1 C20.1 L1.2 U13.1), DebugBoard3V3Mux (C26.1 R18.1 U3.2)
+5V_LIM: DebugBoard5VMux (C2.1 U5.7), DebugBoardLimiters (U15.5)
+5V_PSU: DebugBoard (TP1.1), DebugBoardMuxes (D5.C D8.2), DebugBoard5VMux (R23.1 R29.1), DebugBoardLimiters (C46.1 R61.1 U15.4)
+5V_RF_LIM: DebugBoardMuxes (C24.1 U7.7), DebugBoardLimiters (U16.5)
+5V_RF_PSU: DebugBoard (TP4.1), DebugBoardMuxes (D6.C D9.1 R32.1), DebugBoardLimiters (C47.1 R65.1 U16.4)
+5V_RF_TGT: DebugBoard (J1.4 P3.4), DebugBoardMuxes (C37.1 C38.1 U7.1 U7.8)
+5V_TGT: DebugBoard (J1.2 P3.2), DebugBoardPowerControl (R52.1), DebugBoard5VMux (C34.1 C35.1 U5.1 U5.8)
+12V_LIM: DebugBoardMuxes (C25.1 U8.7), DebugBoardLimiters (U17.5)
+12V_PSU: DebugBoard (TP2.1), DebugBoardMuxes (D7.C D9.2 R35.1), DebugBoardLimiters (C48.1 R69.1 U17.4)
+12V_TGT: DebugBoard (J1.3 P3.3), DebugBoardMuxes (C40.1 C41.1 U8.1 U8.8), DebugBoardPowerControl (R54.1)
+VBUS: DebugBoard (5 pins), DebugBoardMuxes (D10.1 D10.2)
+VBUS_PROT: DebugBoard (7 pins), DebugBoard5VMux (C3.1 R27.1 U5.2)
GND: DebugBoard (39 pins), DebugBoardMuxes (34 pins), DebugBoardPowerControl (18 pins), DebugBoard3V3Mux (11 pins), DebugBoard5VMux (11 pins), DebugBoardLimiters (19 pins)
XREF_2V5: DebugBoardMuxes (C29.1 R13.2 U10.1), DebugBoard3V3Mux (U3.3), DebugBoard5VMux (U5.3)
ADC_3V3: DebugBoard (U1.GP26_A0), DebugBoardPowerControl (C42.1 R50.2 R51.1)
ADC_5V: DebugBoard (U1.GP27_A1), DebugBoardPowerControl (C43.1 R52.2 R53.1)
ADC_12V: DebugBoard (U1.GP28_A2), DebugBoardPowerControl (C44.1 R54.2 R55.1)
DIS_3V3: DebugBoardPowerControl (Q1.3 R38.1 SW1.1), DebugBoard3V3Mux (D12.3)
DIS_5V: DebugBoardPowerControl (Q2.3 R41.1 SW1.2), DebugBoard5VMux (D14.3)
DIS_5VRF: DebugBoardMuxes (D15.3), DebugBoardPowerControl (Q3.3 R44.1 SW1.3)
DIS_12V: DebugBoardMuxes (D16.3), DebugBoardPowerControl (Q4.3 R47.1 SW1.4)
EN_3V3: DebugBoard (U1.GP16), DebugBoardPowerControl (R39.1)
EN_5V: DebugBoard (U1.GP17), DebugBoardPowerControl (R42.1)
EN_5VRF: DebugBoard (U1.GP18), DebugBoardPowerControl (R45.1)
EN_12V: DebugBoard (U1.GP19), DebugBoardPowerControl (R48.1)
PICO_ST_3V3: DebugBoard (U1.GP14), DebugBoardPowerControl (R56.2)
PICO_ST_5V: DebugBoard (U1.GP15), DebugBoardPowerControl (R57.2)
ST_3V3: DebugBoardPowerControl (R56.1), DebugBoard3V3Mux (R16.2 R17.1 U3.9)
ST_5V: DebugBoardPowerControl (R57.1), DebugBoard5VMux (R25.2 R26.1 U5.9)